# EasyEDA Pro project ros小车控制板.epro, schematic ROS-CAR-SCH

## Sheets
1 Battery: Board Name: 1.GCARCv5_2; Create Date: 2024-12-23; Page Name: v5.2电源; Project Name: 通用小车控制器sGCARC; Schematic Name: v5.2SCH; Update Date: 2025-01-11; Company: 湖南工业职业技术学院; Drawed: 唐杰; Page Size: A3; Part Number: JLCPCB-001; Reviewed: 唐杰; Version: v5.2
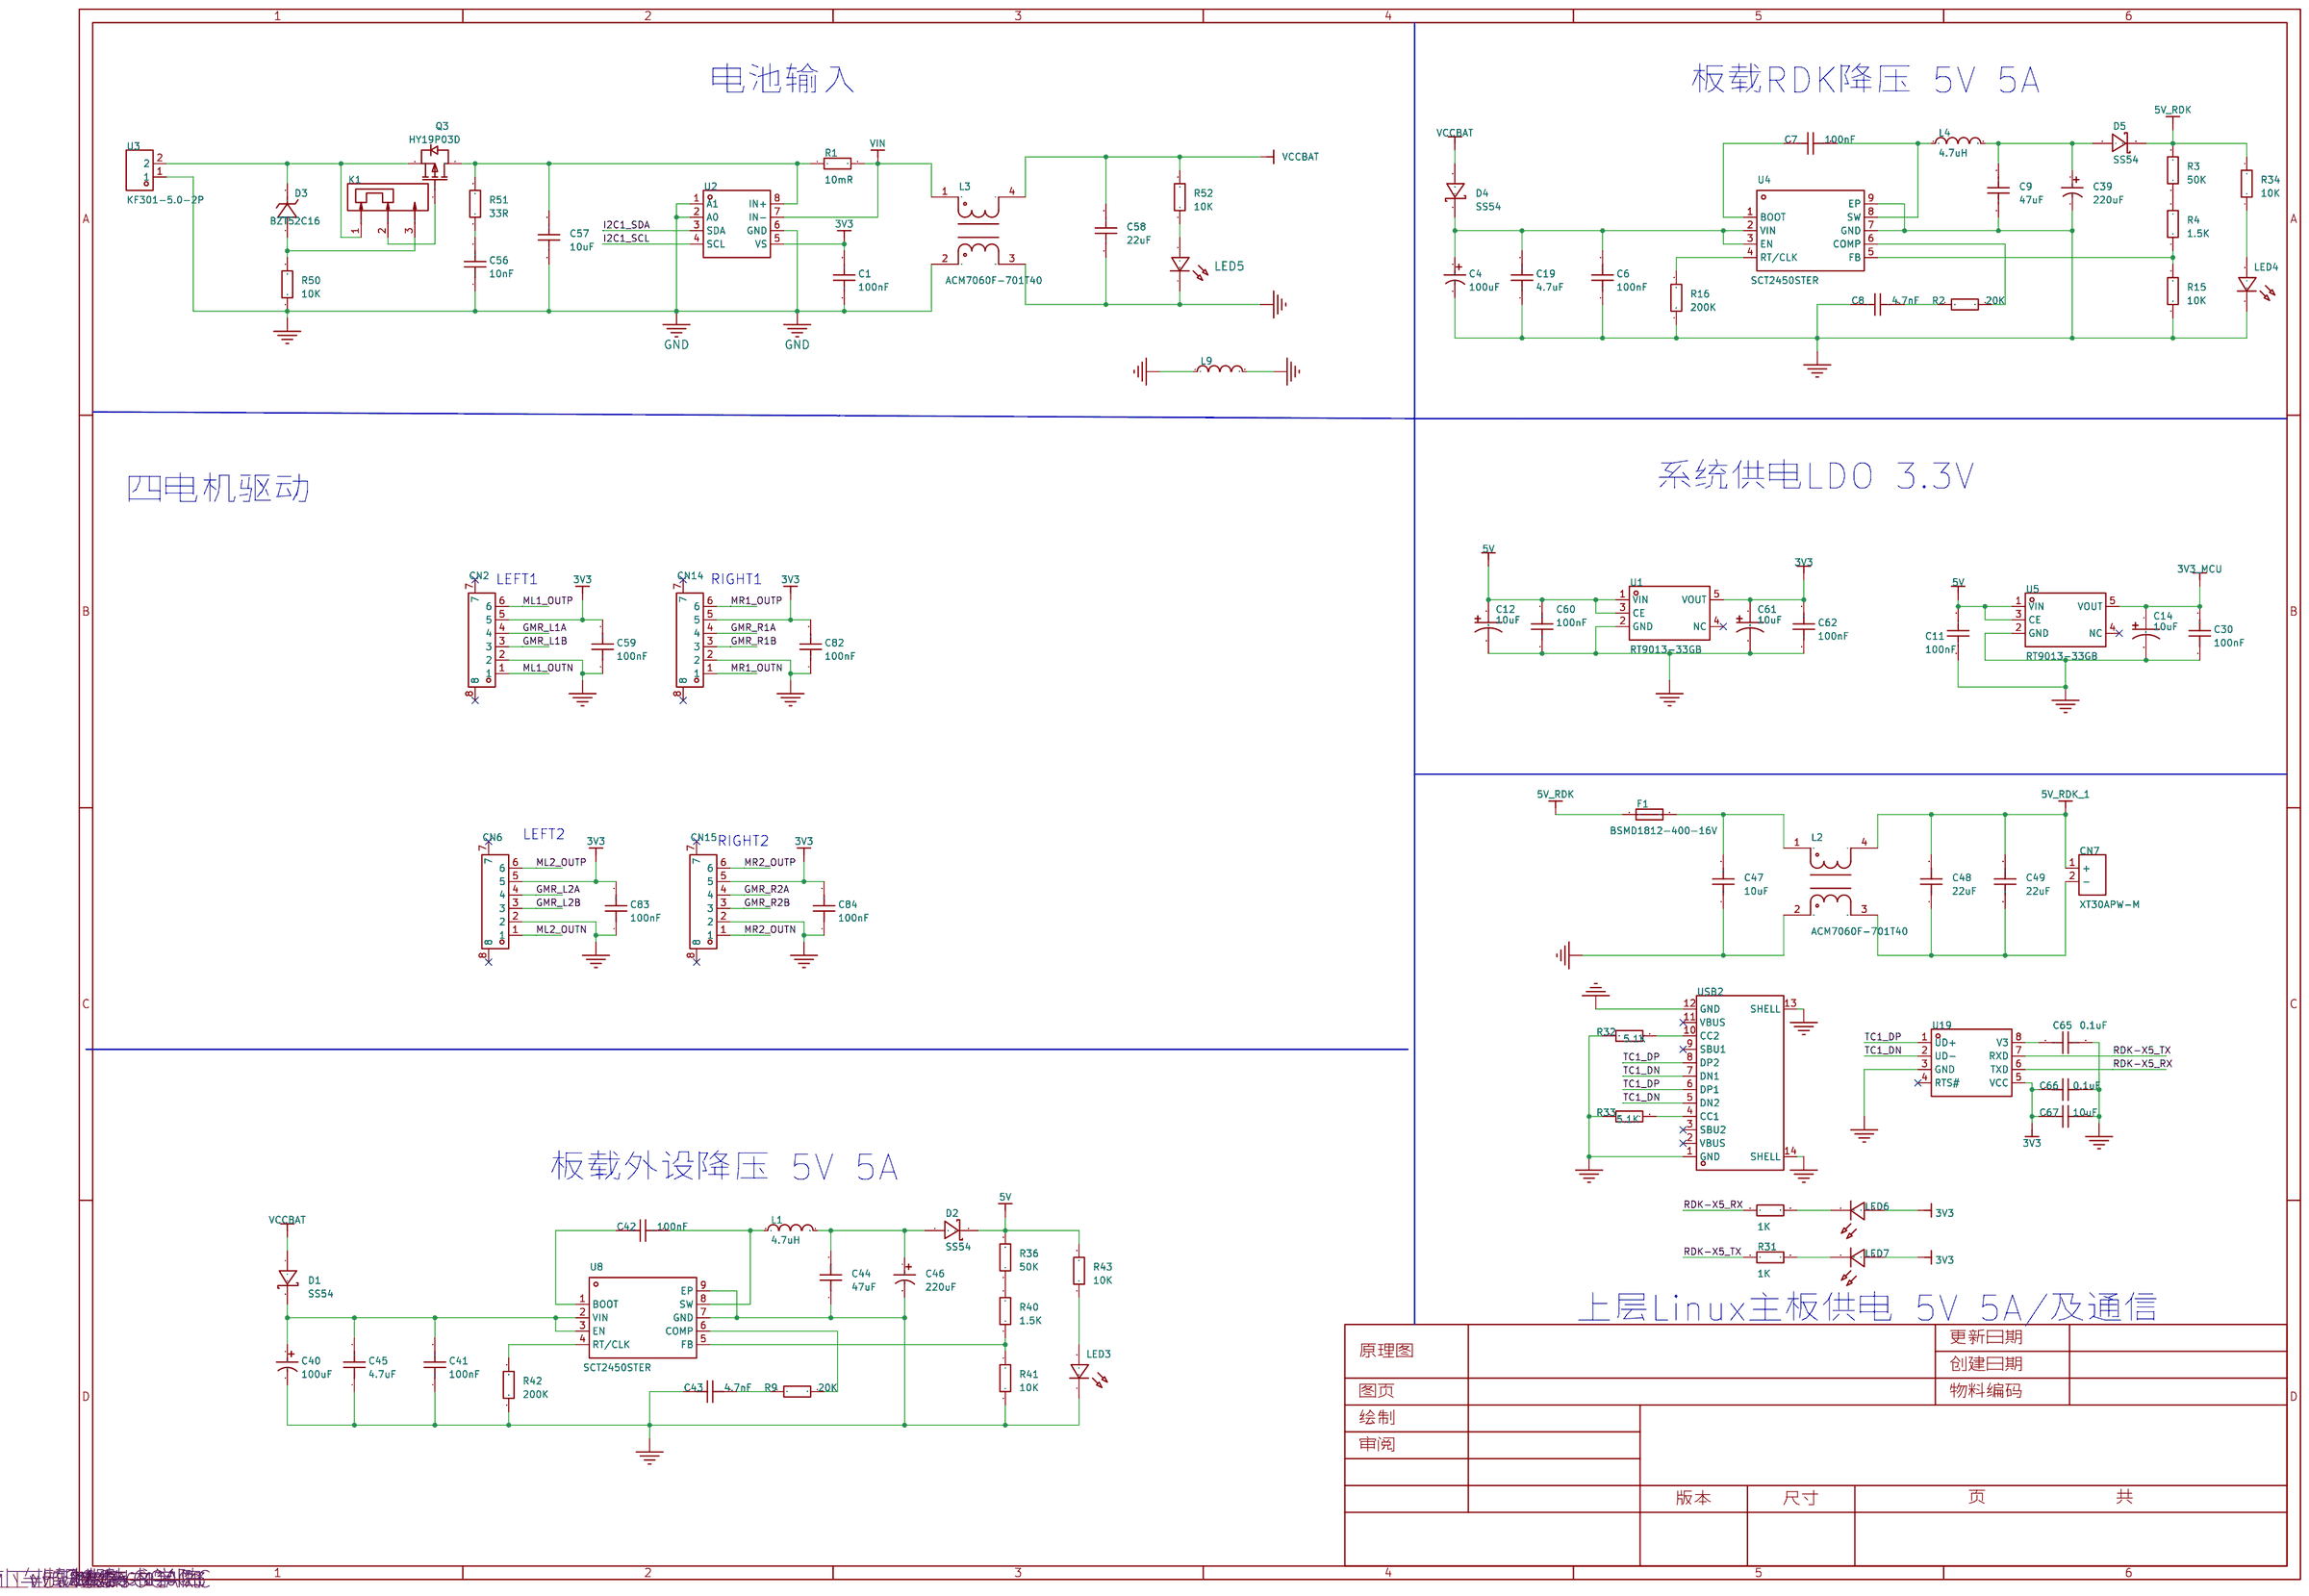
[diagram p0: Battery]
2 function: Page Name: v5.2功能
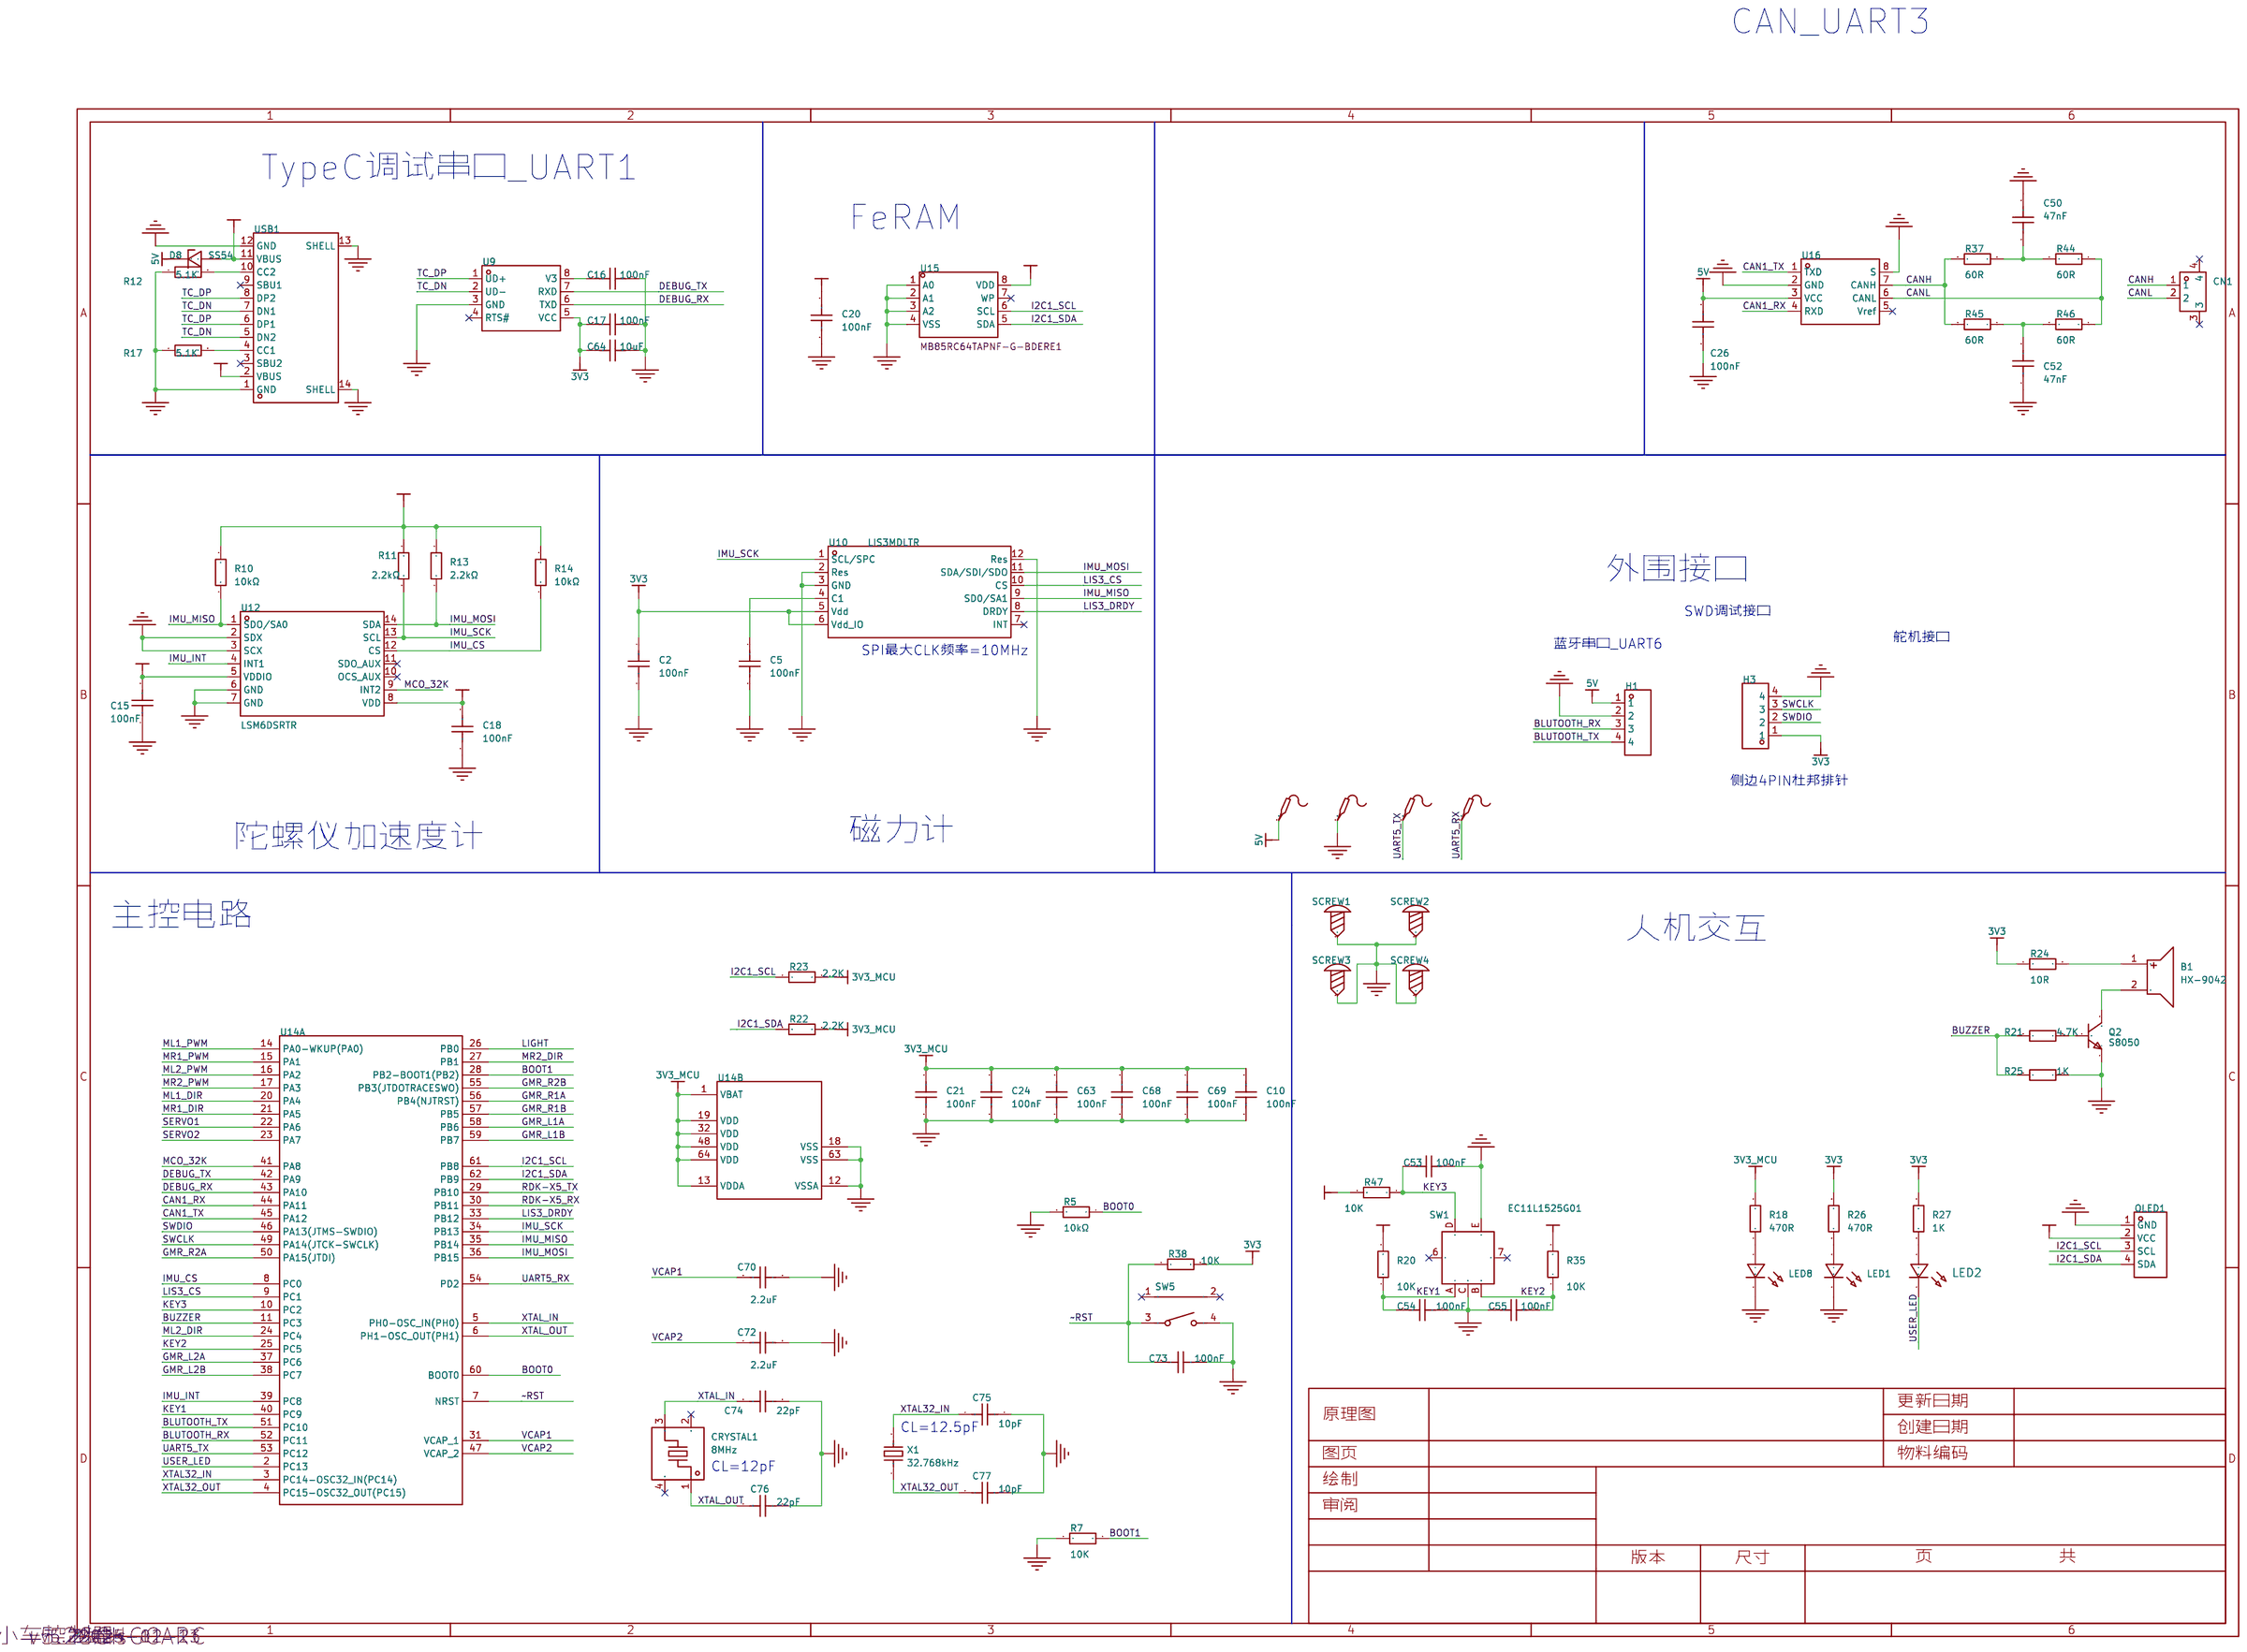
[diagram p1: function]
3 Driver: Assembly Variant: Basic; Board Name: ROS-CAR; Create Date: 2026-07-26; Page Name: P1; Project Name: ros小车控制板V2.0; Schematic Name: ROS-CAR-SCH; Update Date: 2026-07-26; BladeWidth: 10; Company: 嘉立创EDA; Page Size: A4; RegionStart: 1; ShowBorder: 1; TitleBlock: 1; TitleBlockPosition: 3; Version: V1.0; XRegionCount: 6; YRegionCount: 4
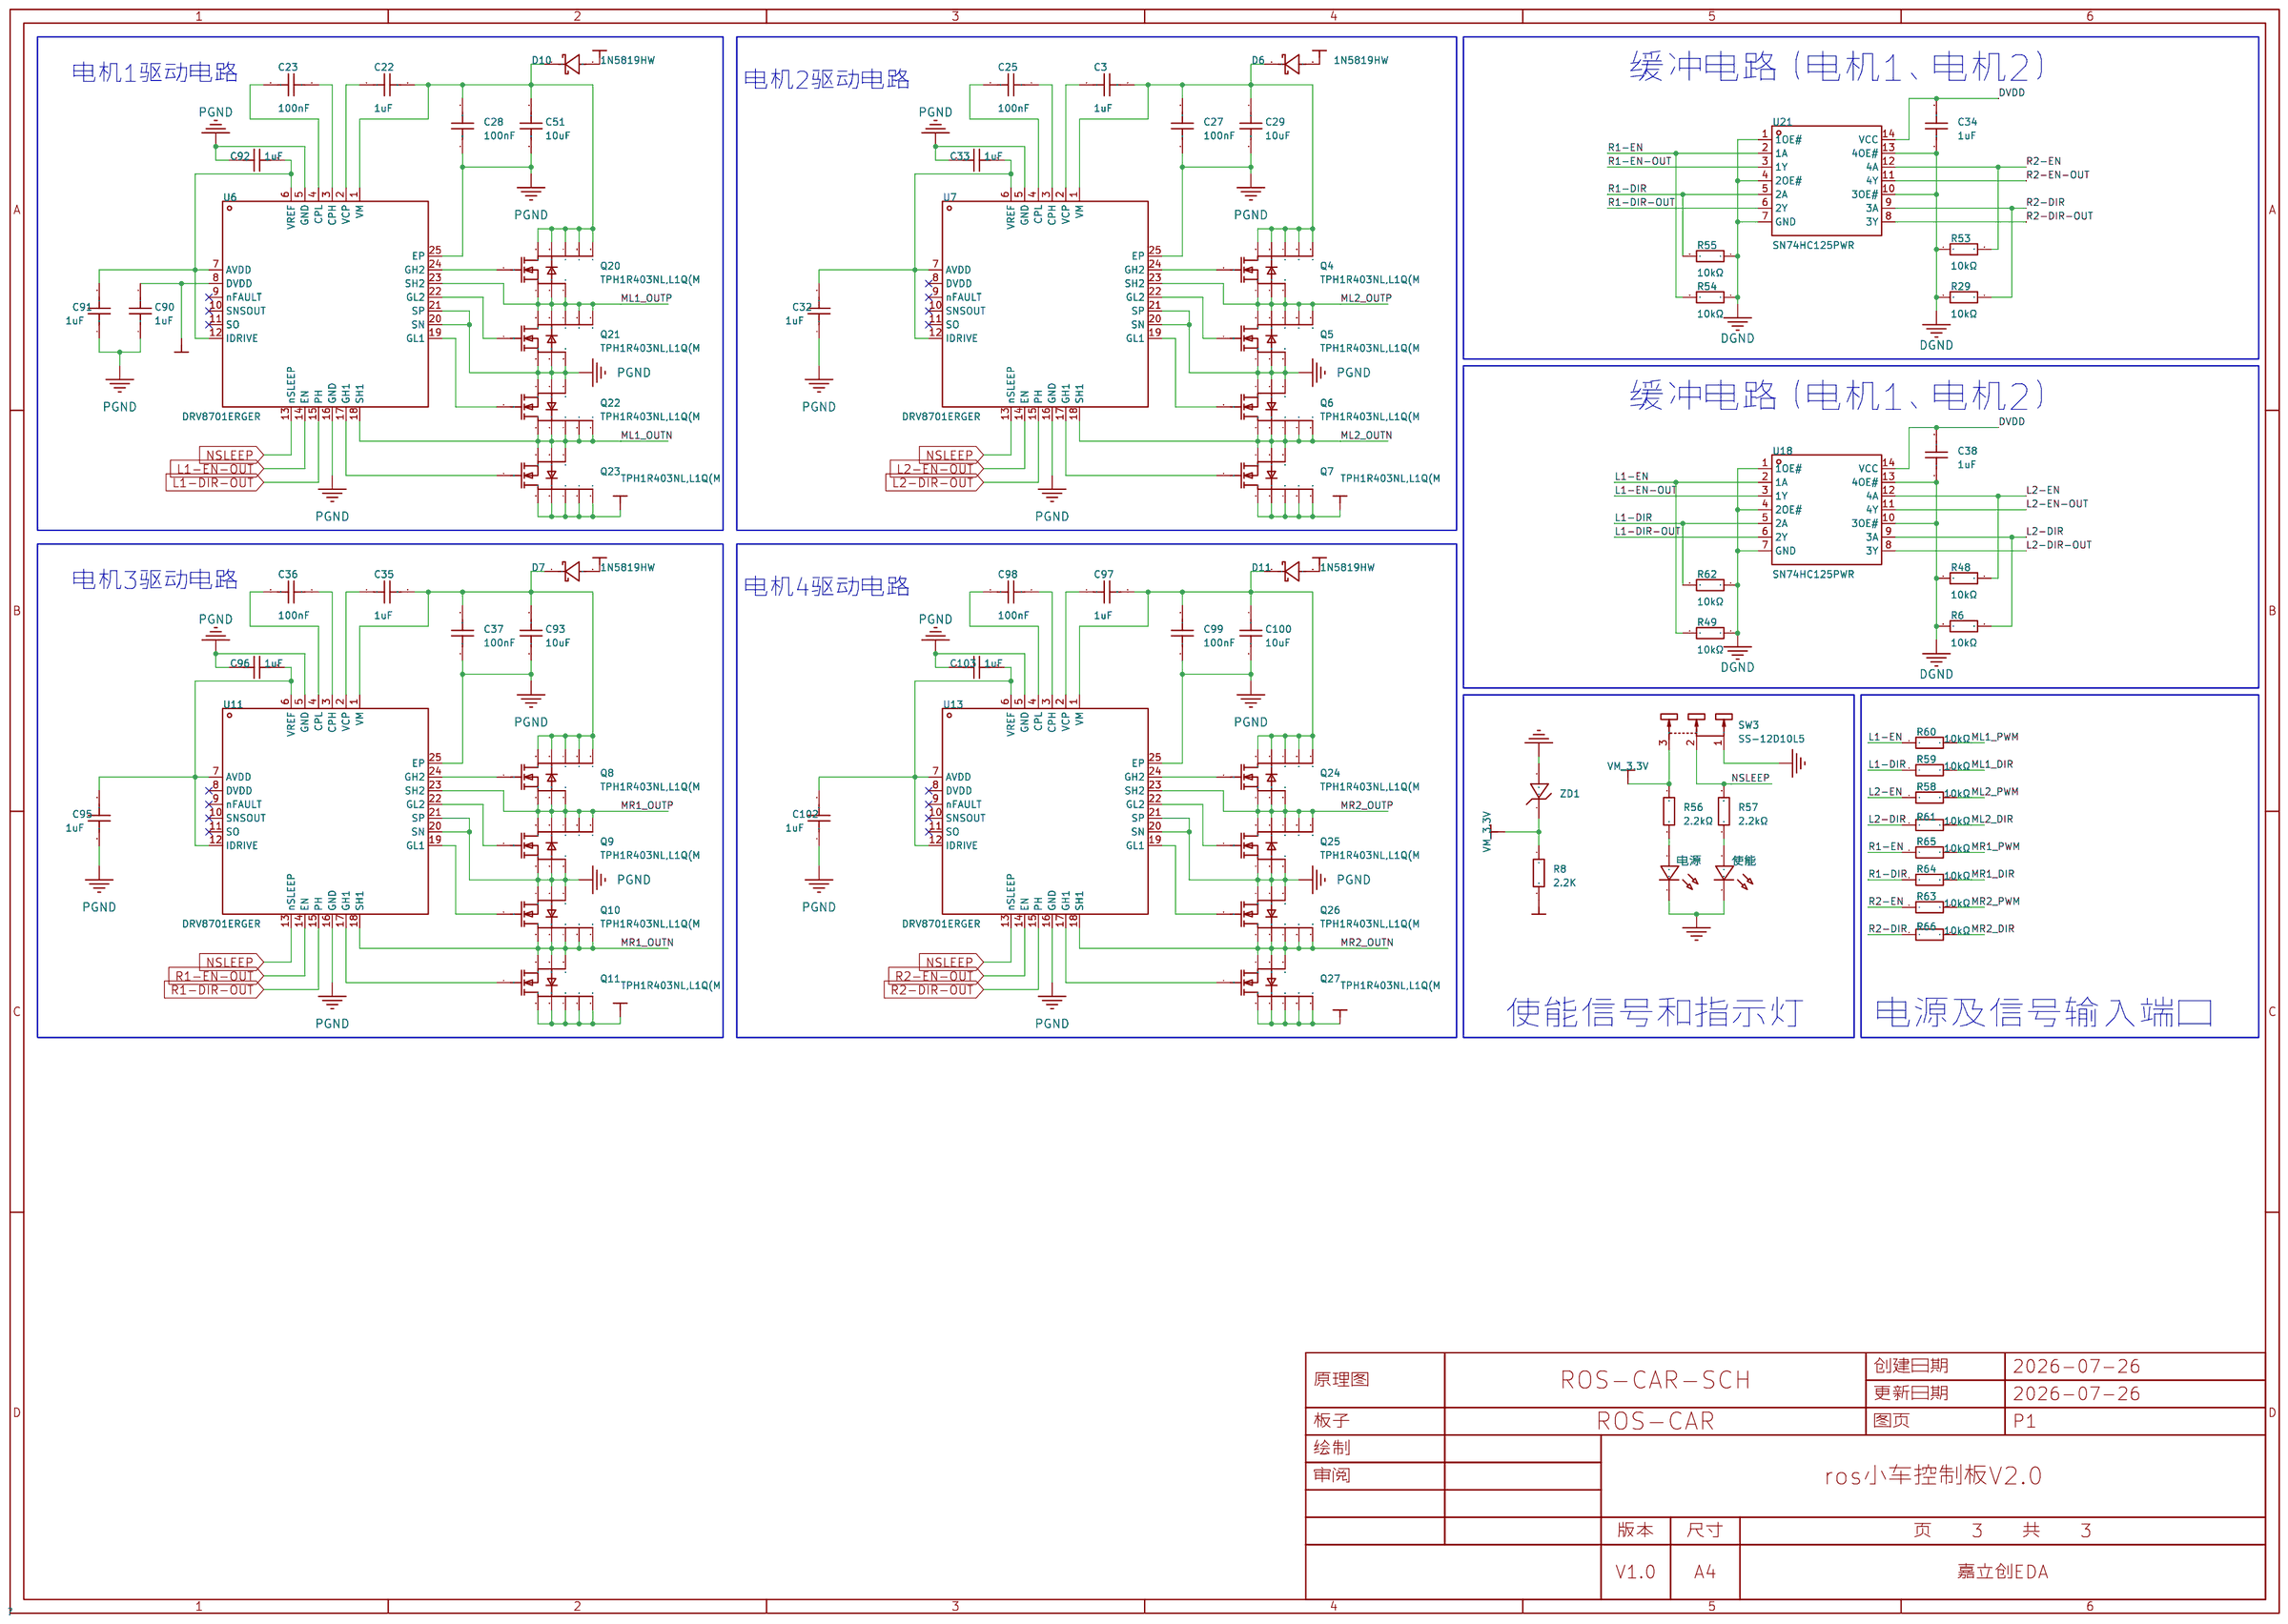
[diagram p2: Driver]

## Parts
sheet Battery
C1  100nF  [C0603]
C4  100uF  [CAP-SMD_BD6.3-L6.6-W6.6-LS7.6-FD-1]
C6  100nF  [C0603]
C7  100nF  [C0603]
C8  100nF  [C0603]
C9  100nF  [C1206]
C11  100nF  [C0603]
C12  10uF  [CAP-SMD_L3.2-W1.6]
C14  10uF  [CAP-SMD_L3.2-W1.6]
C19  100nF  [C1206]
C30  100nF  [C0603]
C39  220uF  [CAP-SMD_BD6.3-L6.6-W6.6-LS7.2-FD]
C40  100uF  [CAP-SMD_BD6.3-L6.6-W6.6-LS7.6-FD-1]
C41  100nF  [C0603]
C42  100nF  [C0603]
C43  100nF  [C0603]
C44  100nF  [C1206]
C45  100nF  [C1206]
C46  220uF  [CAP-SMD_BD6.3-L6.6-W6.6-LS7.2-FD]
C47  10uF  [C1206]
C48  22uF  [C1206]
C49  22uF  [C1206]
C56  100nF  [C0603]
C57  10uF  [C1206]
C58  22uF  [C1206]
C59  100nF  [C0603]
C60  100nF  [C0603]
C61  10uF  [CAP-SMD_L3.2-W1.6]
C62  100nF  [C0603]
C65  0.1uF  [C0603]
C66  0.1uF  [C0603]
C67  100nF  [C0603]
C82  100nF  [C0603]
C83  100nF  [C0603]
C84  100nF  [C0603]
CN2  HCZZ0021-6  [CONN-SMD_HCZZ0021-6]
CN6  HCZZ0021-6  [CONN-SMD_HCZZ0021-6]
CN7  XT30APW-M  [CONN-TH_XT30APW-M]
CN14  HCZZ0021-6  [CONN-SMD_HCZZ0021-6]
CN15  HCZZ0021-6  [CONN-SMD_HCZZ0021-6]
D1  SS54  [SMA_L4.4-W2.8-LS5.4-R-RD]
D2  SS54  [SMA_L4.4-W2.8-LS5.4-R-RD]
D3  BZT52C16  [SOD-123_L2.7-W1.6-LS3.7-RD]
D4  SS54  [SMA_L4.4-W2.8-LS5.4-R-RD]
D5  SS54  [SMA_L4.4-W2.8-LS5.4-R-RD]
F1  BSMD1812-400-16V  [F1812]
K1  -  [SW-TH_SS-12D10-G050]
L1  4.7uH  [IND-SMD_L5.5-W5.2]
L2  ACM7060F-701T40  [FILTER-SMD_4P-L7.0-W6.0-TL_ACM7060F]
L3  ACM7060F-701T40  [FILTER-SMD_4P-L7.0-W6.0-TL_ACM7060F]
L4  4.7uH  [IND-SMD_L5.5-W5.2]
L9  FBMA-11-160808-221A20T  [L0603]
LED3  -  [LED_0603]
LED4  -  [LED_0603]
LED5  -  [LED_0603]
LED6  -  [LED_0603]
LED7  -  [LED_0603]
Q3  HY19P03D  [TO-252-3_L6.5-W5.8-P4.58-BL]
R1  10mR  [R1206]
R2  10K  [R0603_2]
R3  10K  [R0603_2]
R4  1.5K  [R0603_2]
R9  10K  [R0603_2]
R15  10K  [R0603_2]
R16  10K  [R0603_2]
R30  10K  [R0603_2]
R31  10K  [R0603_2]
R32  5.1K  [R0603]
R33  5.1K  [R0603]
R34  10K  [R0603_2]
R36  10K  [R0603_2]
R40  1.5K  [R0603_2]
R41  10K  [R0603_2]
R42  10K  [R0603_2]
R43  10K  [R0603_2]
R50  10K  [R0603_2]
R51  10K  [R0603_2]
R52  10K  [R0603_2]
U1  RT9013-33GB  [SOT-23-5_L2.9-W1.6-P0.95-LS2.8-BR]
U2  INA219AID  [SOIC-8_L4.9-W3.9-P1.27-LS6.0-BL]
U3  KF301-5.0-2P  [CONN-TH_P5.00_KF301-5.0-2P]
U4  SCT2450STER  [ESOP-8_L4.9-W3.9-P1.27-LS6.0-BL-EP]
U5  RT9013-33GB  [SOT-23-5_L2.9-W1.6-P0.95-LS2.8-BR]
U8  SCT2450STER  [ESOP-8_L4.9-W3.9-P1.27-LS6.0-BL-EP]
U19  CH340N  [SOP-8_L4.9-W3.9-P1.27-LS6.0-BL]
USB2  TYPE-C 16PIN 2MD(073)  [USB-C-SMD_TYPE-C-6PIN-2MD-073]
sheet Driver
C3  1uF  [C0603_3]
C22  1uF  [C0603_3]
C23  100nF  [C0603_3]
C25  100nF  [C0603_3]
C27  100nF  [C0603_3]
C28  100nF  [C0603_3]
C29  10uF  [C0603_3]
C32  1uF  [C0603_3]
C33  1uF  [C0603_3]
C34  1uF  [C0603_3]
C35  1uF  [C0603_3]
C36  100nF  [C0603_3]
C37  100nF  [C0603_3]
C38  1uF  [C0603_3]
C51  10uF  [C0603_3]
C90  1uF  [C0603_3]
C91  1uF  [C0603_3]
C92  1uF  [C0603_3]
C93  10uF  [C0603_3]
C95  1uF  [C0603_3]
C96  1uF  [C0603_3]
C97  1uF  [C0603_3]
C98  100nF  [C0603_3]
C99  100nF  [C0603_3]
C100  10uF  [C0603_3]
C102  1uF  [C0603_3]
C103  1uF  [C0603_3]
D6  1N5819HW  [SOD-123_L2.7-W1.6-LS3.7-RD-1]
D7  1N5819HW  [SOD-123_L2.7-W1.6-LS3.7-RD-1]
D10  1N5819HW  [SOD-123_L2.7-W1.6-LS3.7-RD-1]
D11  1N5819HW  [SOD-123_L2.7-W1.6-LS3.7-RD-1]
Q4  TPH1R403NL,L1Q(M  [DSOP-8_L5.0-W5.0-P1.27-LS6.0-BL-EP]
Q5  TPH1R403NL,L1Q(M  [DSOP-8_L5.0-W5.0-P1.27-LS6.0-BL-EP]
Q6  TPH1R403NL,L1Q(M  [DSOP-8_L5.0-W5.0-P1.27-LS6.0-BL-EP]
Q7  TPH1R403NL,L1Q(M  [DSOP-8_L5.0-W5.0-P1.27-LS6.0-BL-EP]
Q8  TPH1R403NL,L1Q(M  [DSOP-8_L5.0-W5.0-P1.27-LS6.0-BL-EP]
Q9  TPH1R403NL,L1Q(M  [DSOP-8_L5.0-W5.0-P1.27-LS6.0-BL-EP]
Q10  TPH1R403NL,L1Q(M  [DSOP-8_L5.0-W5.0-P1.27-LS6.0-BL-EP]
Q11  TPH1R403NL,L1Q(M  [DSOP-8_L5.0-W5.0-P1.27-LS6.0-BL-EP]
Q20  TPH1R403NL,L1Q(M  [DSOP-8_L5.0-W5.0-P1.27-LS6.0-BL-EP]
Q21  TPH1R403NL,L1Q(M  [DSOP-8_L5.0-W5.0-P1.27-LS6.0-BL-EP]
Q22  TPH1R403NL,L1Q(M  [DSOP-8_L5.0-W5.0-P1.27-LS6.0-BL-EP]
Q23  TPH1R403NL,L1Q(M  [DSOP-8_L5.0-W5.0-P1.27-LS6.0-BL-EP]
Q24  TPH1R403NL,L1Q(M  [DSOP-8_L5.0-W5.0-P1.27-LS6.0-BL-EP]
Q25  TPH1R403NL,L1Q(M  [DSOP-8_L5.0-W5.0-P1.27-LS6.0-BL-EP]
Q26  TPH1R403NL,L1Q(M  [DSOP-8_L5.0-W5.0-P1.27-LS6.0-BL-EP]
Q27  TPH1R403NL,L1Q(M  [DSOP-8_L5.0-W5.0-P1.27-LS6.0-BL-EP]
R6  10kΩ  [R0603_6]
R8  2.2K  [R0603_7]
R29  10kΩ  [R0603_6]
R48  10kΩ  [R0603_6]
R49  10kΩ  [R0603_6]
R53  10kΩ  [R0603_6]
R54  10kΩ  [R0603_6]
R55  10kΩ  [R0603_6]
R56  2.2kΩ  [R0603_6]
R57  2.2kΩ  [R0603_6]
R58  10kΩ  [R0603_6]
R59  10kΩ  [R0603_6]
R60  10kΩ  [R0603_6]
R61  10kΩ  [R0603_6]
R62  10kΩ  [R0603_6]
R63  10kΩ  [R0603_6]
R64  10kΩ  [R0603_6]
R65  10kΩ  [R0603_6]
R66  10kΩ  [R0603_6]
SW3  SS-12D10L5  [SW-TH_SS-12D10L5]
U6  DRV8701ERGER  [VQFN-24_L4.0-W4.0-P0.50-BL-EP2.5_1]
U7  DRV8701ERGER  [VQFN-24_L4.0-W4.0-P0.50-BL-EP2.5_1]
U11  DRV8701ERGER  [VQFN-24_L4.0-W4.0-P0.50-BL-EP2.5_1]
U13  DRV8701ERGER  [VQFN-24_L4.0-W4.0-P0.50-BL-EP2.5_1]
U18  SN74HC125PWR  [TSSOP-14_L5.0-W4.4-P0.65-LS6.5-BL]
U21  SN74HC125PWR  [TSSOP-14_L5.0-W4.4-P0.65-LS6.5-BL]
ZD1  BZT52C3V3  [SOD-123_L2.8-W1.8-LS3.7-RD]
使能  NCD0603Y2  [LED0603-RD]
电源  NCD0603Y2  [LED0603-RD]
sheet function
5V  -  [Test-Point-0.5mm]
B1  HX-9042  [BUZ-TH_BD9.0-P4.00-D0.6-FD]
C2  100nF  [C0603_1]
C5  100nF  [C0603_1]
C10  100nF  [C0603_1]
C15  100nF  [C0603_1]
C16  100nF  [C0603_1]
C17  100nF  [C0603_1]
C18  100nF  [C0603_1]
C20  100nF  [C0603_1]
C21  100nF  [C0603_1]
C24  100nF  [C0603_1]
C26  100nF  [C0603_1]
C50  47nF  [C0603]
C52  47nF  [C0603]
C53  100nF  [C0603_1]
C54  100nF  [C0603_1]
C55  100nF  [C0603_1]
C63  100nF  [C0603_1]
C64  100nF  [C0603]
C68  100nF  [C0603_1]
C69  100nF  [C0603_1]
C70  2.2uF  [C0603_5]
C72  2.2uF  [C0603_5]
C73  100nF  [C0603_1]
C74  22pF  [C0603_5]
C75  10pF  [C0603_5]
C76  22pF  [C0603_5]
C77  10pF  [C0603_5]
CN1  ZX-XH2.54-2PWT  [CONN-SMD_2P-P2.54_MEGASTAR_ZX-XH2.54-2PWT]
CRYSTAL1  8MHz  [CRYSTAL-SMD_4P-L3.2-W2.5-BL_SIT8008BI_1]
D8  SS54  [SMA_L4.3-W2.6-LS5.0-FD]
GND  -  [Test-Point-0.5mm]
H1  -  [HDR-TH_4P-P2.54-V-F]
H3  PZ254R-11-04P  [HDR-TH_4P-P2.54-H-M-W10.4]
LED1  -  [LED_0603]
LED2  -  [LED_0603]
LED8  -  [LED_0603]
OLED1  HS96L01W4S03  [OLED-TH_HS96L01W4S03]
Q2  S8050  [SOT-23-3_L2.9-W1.3-P1.90-LS2.4-BR]
R5  10kΩ  [R0603_1]
R7  10K  [R0603_8]
R10  10kΩ  [R0603_1]
R11  2.2kΩ  [R0603_1]
R12  5.1K  [R0603]
R13  2.2kΩ  [R0603_1]
R14  10kΩ  [R0603_1]
R17  5.1K  [R0603]
R18  470R  [R0603]
R20  10K  [R0603]
R21  10K  [R0603_2]
R22  2.2K  [R0603_8]
R23  2.2K  [R0603_8]
R24  10K  [R0603_2]
R25  10K  [R0603_2]
R26  470R  [R0603]
R27  1K  [R0603]
R35  10K  [R0603]
R37  60R  [R0603]
R38  10K  [R0603_8]
R44  60R  [R0603]
R45  60R  [R0603]
R46  60R  [R0603]
R47  10K  [R0603]
RX  -  [Test-Point-0.5mm]
SCREW1  -  [M3螺丝]
SCREW2  -  [M3螺丝]
SCREW3  -  [M3螺丝]
SCREW4  -  [M3螺丝]
SW1  EC11L1525G01  [SW-TH_ALPS_EC11L1525G01]
SW5  TS24CA  [SW-SMD_TS24CA_1]
TX  -  [Test-Point-0.5mm]
U9  CH340N  [SOP-8_L4.9-W3.9-P1.27-LS6.0-BL]
U10  LIS3MDLTR  [LGA-12_L2.0-W2.0-P0.50-BL]
U12  LSM6DSRTR  [LGA-14_L3.0-W2.5-P0.50-BR]
U14  STM32F405RGT6  [LQFP-64_L10.0-W10.0-P0.50-LS12.0-BL]  (sections 1,2)
U15  MB85RC64TAPNF-G-BDERE1  [SOP-8_L5.0-W4.0-P1.27-LS6.0-BL]
U16  TJA1050T-JSM  [SOIC-8_L4.9-W3.9-P1.27-LS6.0-BL]
USB1  TYPE-C 16PIN 2MD(073)  [USB-C-SMD_TYPE-C-6PIN-2MD-073]
X1  32.768kHz  [OSC-SMD_L3.2-W1.5]

## Library data of the parts
C1 C6-C8 C11 C30 C41-C43 C50 C52 C56 C59 C60 C62 C64-C67 C70 C72 C74-C77 C82-C84 = CAP_0603: Supplier Footprint: 0603
C4 C40 = RVE100UF35V67RV0072: 容值:100uF;精度:±20%;额定电压:35V;纹波电流:230mA@120Hz;等效串联电阻:600mΩ@100kHz;; LCSC Part Name: 100uF ±20% 35V; Supplier Part: C2836437; Manufacturer: KNSCHA(科尼盛); Supplier Footprint: SMD,D6.3xL7.7mm; JLCPCB Part Class: Extended Part; Datasheet: https://atta.szlcsc.com/upload/public/pdf/source/20220719/B52EB46F8A1558448ED03D8B4CB3C24F.pdf; Supplier: LCSC; Tolerance: ±20%; Rated Voltage: 35V; Ripple Current: 230mA@120Hz; Equivalent Series Resistance(ESR): 600mΩ@100kHz; φD: 6.3mm; L: 7.7mm; Lifetime @ Temp: 2000hrs@105℃; Operating Temperature: -55℃~+105℃
C9 C19 C44 C45 = CAP_1206: Supplier Footprint: 1206
C12 C14 C61 = CA45-106K016AT: 容值:10uF;精度:±10%;额定电压:16V;等效串联电阻:7Ω@100kHz;; LCSC Part Name: 10uF ±10% 16V; Supplier Part: C219747; Manufacturer: TANCAP(容电); Supplier Footprint: CASE-A-3216; JLCPCB Part Class: Extended Part; Datasheet: https://atta.szlcsc.com/upload/public/pdf/source/20180524/C219747_DA6D26CF659D253885244B1850EB1E9F.pdf; Supplier: LCSC; Tolerance: ±10%; Rated Voltage: 16V; Equivalent Series Resistance(ESR): 7Ω@100kHz; Operating Temperature: -55℃~+85℃
C39 C46 = RST220UF25V019: 容值:220uF;精度:±20%;额定电压:25V;纹波电流:165mA@120Hz;等效串联电阻:-;; LCSC Part Name: 220uF ±20% 25V; Supplier Part: C4747974; Manufacturer: KNSCHA(科尼盛); Supplier Footprint: SMD,D6.3xL7.7mm; JLCPCB Part Class: Extended Part; Datasheet: https://atta.szlcsc.com/upload/public/pdf/source/20220722/2E7F51AC9BE193B364DA1207D7353D66.pdf; Supplier: LCSC; Tolerance: ±20%; Rated Voltage: 25V; Ripple Current: 165mA@120Hz; φD: 6.3mm; L: 7.7mm; Lifetime @ Temp: 2000hrs@105℃; Operating Temperature: -40℃~+105℃
C47 C57 = CL31A106KAHNNNE: 容值:10uF;精度:±10%;额定电压:25V;材质(温度系数):X5R;; LCSC Part Name: 10uF ±10% 25V; Supplier Part: C9807; Manufacturer: SAMSUNG(三星); Supplier Footprint: 1206; JLCPCB Part Class: Extended Part; Datasheet: https://atta.szlcsc.com/upload/public/pdf/source/20160218/1457707763339.pdf; Supplier: LCSC; Tolerance: ±10%; Voltage Rated: 25V; Temperature Coefficient: X5R
C48 C49 C58 = CL31A226KAHNNNE: 容值:22uF;精度:±10%;额定电压:25V;材质(温度系数):X5R;; LCSC Part Name: 22uF ±10% 25V; Supplier Part: C12891; Manufacturer: SAMSUNG(三星); Supplier Footprint: 1206; JLCPCB Part Class: Basic Part; Datasheet: https://atta.szlcsc.com/upload/public/pdf/source/20160218/1457707763339.pdf; Supplier: LCSC; Tolerance: ±10%; Voltage Rated: 25V; Temperature Coefficient: X5R
CN2 CN6 CN14 CN15 = HCZZ0021-6: 插针结构:1x6P;间距:2.54mm;安装方式:卧贴;参考系列:XH;总PIN数:6P;排数:1;每排PIN数:6;额定电流:3A;触头材质:黄铜;触头镀层:锡;工作温度范围:-25℃~+85℃;; LCSC Part Name: 1x6P 间距:2.54mm 卧贴 系列:XH 米色; Supplier Part: C7433711; Manufacturer: HC(虹成电子); Supplier Footprint: SMD,P=2.54mm,卧贴; JLCPCB Part Class: 扩展库; Datasheet: https://atta.szlcsc.com/upload/public/pdf/source/20230707/EBD34B2F45667F1DC530D7576BB95823.pdf; Supplier: LCSC; Pins Structure: 1x6P; Pitch: 2.54mm; Mounting Style: 卧贴; Reference Series: XH; Number of Pins: 6P; Number of Rows: 1; Number of PINs Per Row: 6; Current Rating (Max): 3A; Contact Material: 黄铜; Contact Plating: 锡; Operating Temperature Range: -25℃~+85℃
CN7 = XT30APW-M: LCSC Part Name: AMASS(艾迈斯)防水锁扣镀金15A二芯插头 PCB板卧式 黄色 公头XT30APW-M; Supplier Part: C5818955; Manufacturer: AMASS(艾迈斯); JLCPCB Part Class: Extended Part; Supplier: LCSC
D1 D2 D4 D5 = SS54_C22452: 正向压降(Vf):550mV@5A;直流反向耐压(Vr):40V;平均整流电流(Io):5A;; LCSC Part Name: 电压:40V 电流:5A; Supplier Part: C22452; Manufacturer: MDD; Supplier Footprint: SMA(DO-214AC); JLCPCB Part Class: 基础库; Datasheet: https://atta.szlcsc.com/upload/public/pdf/source/20230314/529CD85F9B31F69841D3A079BC07E377.pdf; Supplier: LCSC; Forward Voltage (Vf@If): 550mV@5A; Reverse Voltage (Vr): 40V; Average Rectified Current (Io): 5A; Reverse Leakage Current (Ir): 1mA@40V
D3 = BZT52C16: 稳压值(标称值):-;功率:500mW;精度:-;; Supplier Part: C707145; Manufacturer: Slkor(萨科微); Supplier Footprint: SOD-123; JLCPCB Part Class: 扩展库; Datasheet: https://atta.szlcsc.com/upload/public/pdf/source/20200721/C707125_BAEA70ACC1B0F60BBAC1FD71D8806D24.pdf; Supplier: LCSC; Reverse Leakage Current (Ir): 100nA@11.2V; Power Dissipation: 500mW
F1 = BSMD1812-400-16V: 耐压(Vmax):16V;最大电流(Imax):40A;保持电流(Ihold):4A;跳闸电流(Itrip):8A;; LCSC Part Name: 1812 4A 16V 佰宏高电压; Supplier Part: C47263807; Manufacturer: BHFUSE(佰宏); Supplier Footprint: 1812; JLCPCB Part Class: Extended Part; Datasheet: https://item.szlcsc.com/datasheet/BSMD1812-400-16V/49469359.html; Supplier: LCSC; Voltage - Max: 16V; Current - Max: 40A; Hold Current: 4A; Trip Current: 8A; Power Dissipation: 2W; Resistance - Initial (Ri) (Min): 5mΩ; Resistance - Post Trip (R1) (Max): 25mΩ; Time to Trip(Max): 4s; Operating Temperature: -40℃~+85℃
K1 = SS-12D10-G5: LCSC Part Name: 插件大电流拨动开关; Supplier Part: C2998777; Manufacturer: DEALON(德艺隆); Supplier Footprint: 插件; Datasheet: https://atta.szlcsc.com/upload/public/pdf/source/20220428/E10CB334ACBAF32CF4AF8D87DA871CD3.pdf; Supplier: LCSC
L1 L4 = SMMS0530-4R7M: 类型:一体成型电感;电感值:4.7uH;精度:±20%;额定电流:4.5A;饱和电流(Isat):5A;; LCSC Part Name: 4.7uH ±20% 5A; Supplier Part: C181722; Manufacturer: SXN(顺翔诺); Supplier Footprint: SMD; JLCPCB Part Class: Extended Part; Datasheet: https://atta.szlcsc.com/upload/public/pdf/source/20210810/BBF24330FB2F5029F637830BA9C42C0D.pdf; Supplier: LCSC; Type: 一体成型电感; Tolerance: ±20%; Rated Current: 4.5A; Saturation Current (Isat): 5A; DC Resistance (DCR): 60mΩ
L2 L3 = ACM7060F-701T40: 线路数:2;阻抗 @ 频率:700Ω@100MHz;直流电阻(DCR):15mΩ;; Supplier Part: C908568; Manufacturer: Meled(美莱); Supplier Footprint: SMD,7x6mm; JLCPCB Part Class: 扩展库; Datasheet: https://atta.szlcsc.com/upload/public/pdf/source/20201026/C908588_5CEB65C28001E8C7405DCE17723F19DE.pdf; Supplier: LCSC; Number of Lines: 2; Impedance @ Frequency: 700Ω@100MHz; Current Rating: 4A; DC Resistance (DCR): 15mΩ; Voltage Rating - DC: 125V; Operating Temperature: -40℃~+125℃
L9 = FBMA-11-160808-221A20T: 标称阻抗@测试频率:220Ω@100MHz;误差:±25%;直流电阻(RDC):100mΩ;; LCSC Part Name: 单路 0603磁珠 阻抗220Ω@100MHz; Supplier Part: C491561; Manufacturer: Kingcore(钧宝); Supplier Footprint: 0603; JLCPCB Part Class: 扩展库; Datasheet: https://atta.szlcsc.com/upload/public/pdf/source/20200318/C491555_33530977E41FC6ED0B377F6D664F401F.pdf; Supplier: LCSC; Impedance @ Frequency: 220Ω@100MHz; Tolerance: ±25%; DC Resistance: 100mΩ; Current Rating: 2A; Circuits: 1
LED3 LED4 LED7 = LED_0603-G_1: Supplier Footprint: 0603
LED5 = LED_0603-R_1: Supplier Footprint: 0603
LED6 = LED_0603-B: Supplier Footprint: 0603
Q3 = HY19P03D_C330375: 漏源电压（Vdss）:-30V;连续漏极电流（Id）（25°C 时）:90A(Tc);栅源极阈值电压:3V @ 250uA;漏源导通电阻:6mΩ @ 45A,10V;最大功率耗散（Ta=25°C）:50W(Tc);类型:P沟道;; Supplier Part: C330375; Supplier Footprint: TO-252-2L; JLCPCB Part Class: 扩展库; Datasheet: https://atta.szlcsc.com/upload/public/pdf/source/20181108/C330375_BA5D69AA7EC063D0F6F0CEB9136BFE2D.pdf; Supplier: LCSC
R1 = Res_1206: Supplier Footprint: 1206
R2-R4 R7 R9 R12 R15-R18 R20-R27 R30-R38 R40-R47 R50-R52 = Res_0603: Supplier Footprint: 0603
U1 U5 = RT9013-33GB_C19268157: Supplier Part: C19268157; Manufacturer: TECH PUBLIC(台舟); Supplier Footprint: SOT-23-5; JLCPCB Part Class: 扩展库; Datasheet: https://atta.szlcsc.com/upload/public/pdf/source/20231201/9D78CA17020D67EC103F1AC7C29CF260.pdf; Supplier: LCSC
U2 = INA219AID: INA219 26V 12 位 I2C 输出数字功率监测器; Supplier Part: C1574856; Manufacturer: TI(德州仪器); Supplier Footprint: SOIC-8; JLCPCB Part Class: 扩展库; Datasheet: https://www.ti.com/cn/lit/gpn/ina219; Supplier: LCSC
U3 = KF301-5.0-2P: 结构:1x2P;间距:5mm;颜色:蓝色;安装方式:直插;额定电流:17A;额定电压:250V;排数:1;线规 - AWG:14~22;线规 - 平方毫米:1.5;每排PIN数:2;工作温度范围:-30℃~+120℃;; LCSC Part Name: 5mm 1x2P 排数:1 每排P数:2 直插; Supplier Part: C474881; Manufacturer: KEFA(科发); Supplier Footprint: 插件,P=5mm; JLCPCB Part Class: 扩展库; Datasheet: https://atta.szlcsc.com/upload/public/pdf/source/20230317/03A5B5FC229D6F9225E8F51DA1A4E80A.pdf; Supplier: LCSC; Structure: 1x2P; Pitch: 5mm; Color: 蓝色; Mounting Style: 直插; Current Rating (Max): 17A; Voltage Rating (Max): 250V; Number of Pins: 2P; Number of Rows: 1; Wire Gauge - AWG: 14~22; Wire Gauge - mm2: 1.5; Number of PINs Per Row: 2; Operating Temperature Range: -30℃~+120℃
U4 U8 = SCT2450STER: LCSC Part Name: 电源IC; Supplier Part: C509400; Manufacturer: SCT(芯洲科技); Supplier Footprint: ESOP-8; JLCPCB Part Class: 扩展库; Datasheet: https://atta.szlcsc.com/upload/public/pdf/source/20200407/C509400_EDF779A672A59398CFBA9E95FA584FEC.pdf; Supplier: LCSC
U9 U19 = CH340N: Supplier Part: C2977777; Manufacturer: WCH(南京沁恒); Supplier Footprint: SOP-8; JLCPCB Part Class: Extended Part; Datasheet: https://atta.szlcsc.com/upload/public/pdf/source/20220223/82A45E4FF89B3EDCAD50B354450A7EF4.pdf; Supplier: LCSC
USB1 USB2 = TYPE-C 16PIN 2MD(073): 连接器类型:Type-C;标准:-;公母:母;触点数量:16P;端口数量:1;安装方式:卧贴;额定电流 - 电源:5A;工作温度范围:-25℃~+85℃;; LCSC Part Name: Type-C 母 卧贴 带定位柱 不锈钢外壳 2次模顶; Supplier Part: C2765186; Manufacturer: SHOU HAN(首韩); Supplier Footprint: SMD; JLCPCB Part Class: 扩展库; Datasheet: https://atta.szlcsc.com/upload/public/pdf/source/20211123/39B17C16241EAC15C5E277BDA434118E.pdf; Supplier: LCSC; Connector Type: Type-C; Gender: 母; Number of Contacts: 16P; Number of Ports: 1; Mounting Style: 卧贴; Current Rating - Power (Max): 5A; Operating Temperature Range: -25℃~+85℃
C3 C22 C29 C32 C35 C51 C90 C91 C93 C95 C97 C100 C102 = CAP_604: Supplier Footprint: 0603
C23 C25 C27 C28 C36 C37 C98 C99 = CGA0603X7R104K500JT: 容值:100nF;精度:±10%;额定电压:50V;温度系数:X7R;; LCSC Part Name: 100nF ±10% 50V; Supplier Part: C6119867; Manufacturer: HRE(芯声); Supplier Footprint: 0603; JLCPCB Part Class: Extended Part; Datasheet: https://item.szlcsc.com/datasheet/CGA0603X7R104K500JT/7062573.html; Supplier: LCSC; Tolerance: ±10%; Voltage Rating: 50V; Temperature Coefficient: X7R
C33 C34 C38 C92 C96 C103 = CGA0603X5R105K500JT: 容值:1uF;精度:±10%;额定电压:50V;温度系数:X5R;; LCSC Part Name: 1uF ±10% 50V; Supplier Part: C6119852; Manufacturer: HRE(芯声); Supplier Footprint: 0603; JLCPCB Part Class: Extended Part; Datasheet: https://item.szlcsc.com/datasheet/CGA0603X5R105K500JT/7062558.html; Supplier: LCSC; Tolerance: ±10%; Voltage Rating: 50V; Temperature Coefficient: X5R
D6 D7 D10 D11 = 1N5819HW: 二极管配置:-;正向压降(Vf):900mV@3A;直流反向耐压(Vr):40V;整流电流:1A;; LCSC Part Name: 电压:40V 电流:1A; Supplier Part: C2905649; Manufacturer: TECH PUBLIC(台舟); Supplier Footprint: SOD-123; JLCPCB Part Class: 扩展库; Datasheet: https://item.szlcsc.com/datasheet/1N5819HW/3175946.html; Supplier: LCSC; Voltage - Forward(Vf@If): 900mV@3A; Voltage - DC Reverse(Vr): 40V; Current - Rectified: 1A; Reverse Leakage Current (Ir): 1mA@40V; Non-Repetitive Peak Forward Surge Current: 9A
Q4-Q11 Q20-Q27 = TPH1R403NL,L1Q(M: 数量:1个N沟道;漏源电压(Vdss):30V;连续漏极电流(Id):150A;导通电阻(RDS(on)):2.1mΩ@4.5V;耗散功率(Pd):64W;阈值电压(Vgs(th)):2.3V@0.5mA;; LCSC Part Name: 1个N沟道 耐压:30V 电流:150A; Supplier Part: C2940403; Manufacturer: TOSHIBA(东芝); Supplier Footprint: DFN-8(5x6); JLCPCB Part Class: 扩展库; Datasheet: https://item.szlcsc.com/datasheet/TPH1R403NL%252CL1Q(M/3305005.html; Supplier: LCSC; Number: 1个N沟道; Drain to Source Voltage: 30V; Current - Continuous Drain(Id): 150A; RDS(on): 2.1mΩ@4.5V; Pd - Power Dissipation: 64W; Gate Threshold Voltage (Vgs(th)): 2.3V@0.5mA; Gate Charge(Qg): 46nC@10V; Input Capacitance(Ciss): 4.4nF; Reverse Transfer Capacitance (Crss@Vds): 200pF; Type: N沟道; Output Capacitance(Coss): 1.8nF
R6 R29 R48 R49 R53-R55 R58-R66 = 0603WAF1002T5E_1: 电阻类型:厚膜电阻;阻值:10kΩ;精度:±1%;功率:100mW;工作电压:75V;温度系数:±100ppm/℃;; LCSC Part Name: 厚膜电阻 10kΩ ±1% 100mW; Supplier Part: C25804; Manufacturer: UNI-ROYAL(厚声); Manufacturer Part: 0603WAF1002T5E; Supplier Footprint: 0603; JLCPCB Part Class: Basic Part; Datasheet: https://item.szlcsc.com/datasheet/0603WAF1002T5E/26547.html; Supplier: LCSC; Type: 厚膜电阻; Tolerance: ±1%; Power(Watts): 100mW; Voltage-Supply(Max): 75V; Temperature Coefficient: ±100ppm/℃; Operating Temperature: -55℃~+155℃
R8 = Res_604: Supplier Footprint: 0603
R56 R57 = 0603WAF2201T5E_1: 电阻类型:厚膜电阻;阻值:2.2kΩ;精度:±1%;功率:100mW;最大工作电压:75V;温度系数:±100ppm/℃;; LCSC Part Name: 2.2kΩ ±1% 100mW 厚膜电阻; Supplier Part: C4190; Manufacturer: UNI-ROYAL(厚声); Manufacturer Part: 0603WAF2201T5E; Supplier Footprint: 0603; JLCPCB Part Class: Basic Part; Datasheet: https://atta.szlcsc.com/upload/public/pdf/source/20200306/C422600_1E6D84923E4A46A82E41ADD87F860B5C.pdf; Supplier: LCSC; Type: 厚膜电阻; Tolerance: ±1%; Power(Watts): 100mW; Overload Voltage (Max): 75V; Temperature Coefficient: ±100ppm/℃; Operating Temperature Range: -55℃~+155℃
SW3 = SS-12D10L5: 电路结构:单刀双掷;安装方式:直插;开关颜色:黑色;额定电流:3A;额定电压:125V;工作寿命:1万次;; LCSC Part Name: 柄长5mm 直插双档 滑动开关; Supplier Part: C319012; Manufacturer: XKB Connection(中国星坤); Supplier Footprint: 插件,13x6.8mm; JLCPCB Part Class: 扩展库; Datasheet: https://item.szlcsc.com/datasheet/SS-12D10L5/300104.html; Supplier: LCSC; Circuit: 单刀双掷; Actuator Style: 矩形柱状; Termination Style: PC引脚; Length: 13mm; Width: 6.8mm; Switch Height: 6.4mm; Mounting Type: 直插; Actuator Color: 黑色; Current Rating: 3A; Voltage Rating: 125V; Life: 1万次; Operating Temperature: -40℃~+85℃
U6 U7 U11 U13 = DRV8701ERGER: DRV8701 47V H 桥智能栅极驱动器; LCSC Part Name: 有刷直流电机驱动芯片 45V; Supplier Part: C90964; Manufacturer: TI(德州仪器); Supplier Footprint: VQFN-24-EP(4x4); JLCPCB Part Class: 扩展库; Datasheet: https://www.ti.com/cn/lit/gpn/drv8701; Supplier: LCSC
U18 U21 = SN74HC125PWR: 输入类型:-;工作电压:2V~6V;元件数:4;每个元件位数:1;灌电流(IOL):7.8mA;拉电流(IOH):7.8mA;; LCSC Part Name: 三态输出，四路总线缓冲门; Supplier Part: C132994; Manufacturer: TI(德州仪器); Supplier Footprint: TSSOP-14; JLCPCB Part Class: 扩展库; Datasheet: https://www.ti.com/cn/lit/gpn/sn74hc125; Supplier: LCSC; output type: 三态; Voltage - Supply: 2V~6V; Number of Elements: 4; Number of Bits per Element: 1; Current - Output Low(IOL): 7.8mA; Current - Output High(IOH): 7.8mA; Logic Family: 74HC; Operating Temperature: -40℃~+85℃
ZD1 = BZT52C3V3_C2112: 二极管配置:独立式;稳压值(标称值):3.3V;稳压值(范围):3.1V~3.5V;精度:-;功率:350mW;反向电流(Ir):5A@1V;阻抗(Zzt):95Ω;; LCSC Part Name: 3.3V 350mW; Supplier Part: C2112; Manufacturer: CJ（江苏长电/长晶）; Supplier Footprint: SOD-123; JLCPCB Part Class: 扩展库; Datasheet: https://atta.szlcsc.com/upload/public/pdf/source/20170919/C2112_1505799672426977594.pdf; Supplier: LCSC; Diode Configuration: 独立式; Zener Voltage (Nom): 3.3V; Zener Voltage (Range): 3.1V~3.5V; Power Dissipation: 350mW; Reverse Leakage Current (Ir): 5A@1V; Zener Impedance (Zzt): 95Ω
使能 电源 = NCD0603Y2: 发光颜色:黄色;正向电压(VF):1.6V~2.6V;功率:65mW;正向电流:20mA;主波长:586nm~595nm;透镜颜色:无色透明透镜;发光强度:100mcd~220mcd;发光角度:130°;工作温度:-30℃~+85℃;; Supplier Part: C89811; Manufacturer: 国星光电; Supplier Footprint: 0603; JLCPCB Part Class: Extended Part; Datasheet: https://atta.szlcsc.com/upload/public/pdf/source/20200820/C89811_7FE84B429B6BCA3E113B125EE1452576.pdf; Supplier: LCSC; Emitted Color: 黄色; Forward Voltage (VF): 1.6V~2.6V; Power Dissipation: 65mW; Forward Current: 20mA; Dominant Wavelength: 586nm~595nm; Lens Color: 无色透明透镜; Luminous Intensity: 100mcd~220mcd; Viewing Angle: 130°; Operating Temperature: -30℃~+85℃
5V GND RX TX = Test-Point_1: Test Point 测试点
B1 = HX-9042: Supplier Part: C9900014398; Supplier Footprint: 9042; JLCPCB Part Class: 扩展库; Datasheet: https://atta.szlcsc.comnull; Supplier: LCSC
C2 C5 C10 C15-C18 C20 C21 C24 C26 C53-C55 C63 C68 C69 C73 = CC0603KRX7R9BB104: 容值:100nF;精度:±10%;额定电压:50V;温度系数:X7R;; LCSC Part Name: 100nF ±10% 50V; Supplier Part: C14663; Manufacturer: YAGEO(国巨); Supplier Footprint: 0603; JLCPCB Part Class: Basic Part; Datasheet: https://item.szlcsc.com/datasheet/CC0603KRX7R9BB104/15331.html; Supplier: LCSC; Tolerance: ±10%; Voltage Rating: 50V; Temperature Coefficient: X7R
CN1 = ZX-XH2.54-2PWT: 插针结构:1x2P;间距:2.54mm;安装方式:卧贴;参考系列:XH;总PIN数:2P;排数:1;每排PIN数:2;行距:-;额定电流:3A;触头材质:黄铜;触头镀层:锡;工作温度范围:-25℃~+85℃;; Supplier Part: C7429671; Manufacturer: Megastar(兆星); Supplier Footprint: SMD,P=2.54mm,卧贴; JLCPCB Part Class: 扩展库; Datasheet: https://atta.szlcsc.com/upload/public/pdf/source/20230619/D2020A0565D707024C90AEAD14B7AF42.pdf; Supplier: LCSC; Pins Structure: 1x2P; Pitch: 2.54mm; Mounting Style: 卧贴; Reference Series: XH; Number of Pins: 2P; Number of Rows: 1; Number of PINs Per Row: 2; Current Rating (Max): 3A; Contact Material: 黄铜; Contact Plating: 锡; Operating Temperature Range: -25℃~+85℃
CRYSTAL1 = CF4008M00012001: 晶振类型:贴片晶振;频率:8MHz;常温频差:±10ppm;外接负载电容:12pF;频率稳定度(全温):±30ppm;; LCSC Part Name: 8MHz ±10ppm 12pF; Supplier Part: C7294546; Manufacturer: HUAXIN(华昕); Supplier Footprint: SMD-3225-4P; JLCPCB Part Class: 扩展库; Datasheet: https://atta.szlcsc.com/upload/public/pdf/source/20230614/403FD538918E19EFAFACD07D4A487DFF.pdf; Supplier: LCSC; Crystal Type: 贴片晶振; Normal temperature Frequency Tolerance: ±10ppm; External load capacitor: 12pF; Frequency Stability(Full temperature range): ±30ppm; Equivalent Series Resistance (ESR): 40Ω; Operating Temperature: -40℃~+85℃
D8 = SS54_C7420369: 二极管配置:独立式;正向压降(Vf):550mV@5A;直流反向耐压(Vr):40V;整流电流:5A;; LCSC Part Name: 电压:40V 电流:5A; Supplier Part: C7420369; Manufacturer: R+O(宏嘉诚); Supplier Footprint: SMA(DO-214AC); JLCPCB Part Class: Extended Part; Datasheet: https://item.szlcsc.com/datasheet/SS54/8397191.html; Supplier: LCSC; Diode Configuration: 独立式; Voltage - Forward(Vf@If): 550mV@5A; Voltage - DC Reverse(Vr): 40V; Current - Rectified: 5A; Reverse Leakage Current (Ir): 50uA@40V; Operating Junction Temperature Range: -55℃~+125℃; Non-Repetitive Peak Forward Surge Current: 120A
H1 = HDR-F_2.54_1x4P: Supplier Part: C2718488; Supplier Footprint: 插件
H3 = PZ254R-11-04P: 插针结构:1x4P;间距:2.54mm;行距:-;圆针/方针:方针;安装类型:弯插;排数:单排;总PIN位数:4P;额定电流:-;额定电压:-;配合针长度:6mm;塑高:2.5mm;触头材质:黄铜;触头镀层:-;工作温度范围:-40℃~+105℃;颜色:黑色;; LCSC Part Name: 间距:2.54mm 1x4P 弯插 方针; Supplier Part: C492412; Manufacturer: XFCN(兴飞); Supplier Footprint: 弯插,P=2.54mm; JLCPCB Part Class: 扩展库; Datasheet: https://atta.szlcsc.com/upload/public/pdf/source/20200309/C492412_B0EFFC1946AB079B8871416C4A09EF6C.pdf; Supplier: LCSC; Pin Structure: 1x4P; Pitch: 2.54mm; Circluar Pins/Square Pins: 方针; Mounting Type: 弯插; Number of Rows: 单排; Number of Pins: 4P; Length of Mating Pin: 6mm; Insulation Height: 2.5mm; Contact Material: 黄铜; Operating Temperature Range: -40℃~+105℃; Color: 黑色
LED1 LED8 = LED_0603-G: Supplier Footprint: 0603
LED2 = LED_0603-R: Supplier Footprint: 0603
OLED1 = HS96L01W4S03: 尺寸(inch):0.96;像素分辨率:128x64;; LCSC Part Name: 0.96寸 白光 128x64像素分辨率; Supplier Part: C5139758; Manufacturer: HS(汉昇); JLCPCB Part Class: Extended Part; Datasheet: https://item.szlcsc.com/datasheet/HS96L01W4S03/5751920.html; Supplier: LCSC; Size: 0.96; Dot Pixels: 128x64; Operating Temperature: -40℃~+80℃; Type of Drive: 无源(PMOLED); Display Range: 21.74x10.86mm; Display Color: 白色; Luminance: 100cd/m2; Quiescent Current: 5uA
Q2 = S8050: NPN 25V 500mA 120-400 SOT-23; LCSC Part Name: NPN 25V 500mA 120-400 SOT-23; Supplier Part: C2931719; Manufacturer: Doeshare(德芯); Supplier Footprint: SOT-23; JLCPCB Part Class: 扩展库; Datasheet: https://atta.szlcsc.com/upload/public/pdf/source/20220117/E6D3315E0D6ADDB25840BFFAC039C5C0.pdf; Supplier: LCSC
R5 R10 R14 = 0603WAF1002T5E: 电阻类型:厚膜电阻;阻值:10kΩ;精度:±1%;功率:100mW;工作电压:75V;温度系数:±100ppm/℃;; LCSC Part Name: 厚膜电阻 10kΩ ±1% 100mW; Supplier Part: C25804; Manufacturer: UNI-ROYAL(厚声); Supplier Footprint: 0603; JLCPCB Part Class: Basic Part; Datasheet: https://item.szlcsc.com/datasheet/0603WAF1002T5E/26547.html; Supplier: LCSC; Type: 厚膜电阻; Tolerance: ±1%; Power(Watts): 100mW; Voltage-Supply(Max): 75V; Temperature Coefficient: ±100ppm/℃; Operating Temperature: -55℃~+155℃
R11 R13 = 0603WAF2201T5E: 电阻类型:厚膜电阻;阻值:2.2kΩ;精度:±1%;功率:100mW;最大工作电压:75V;温度系数:±100ppm/℃;; LCSC Part Name: 2.2kΩ ±1% 100mW 厚膜电阻; Supplier Part: C4190; Manufacturer: UNI-ROYAL(厚声); Supplier Footprint: 0603; JLCPCB Part Class: Basic Part; Datasheet: https://atta.szlcsc.com/upload/public/pdf/source/20200306/C422600_1E6D84923E4A46A82E41ADD87F860B5C.pdf; Supplier: LCSC; Type: 厚膜电阻; Tolerance: ±1%; Power(Watts): 100mW; Overload Voltage (Max): 75V; Temperature Coefficient: ±100ppm/℃; Operating Temperature Range: -55℃~+155℃
SCREW1-SCREW4 = M3螺丝: Supplier Footprint: 插件
SW1 = EC11L1525G01: Supplier Part: C2991196; Manufacturer: ALPSALPINE(阿尔卑斯阿尔派); Supplier Footprint: 插件; JLCPCB Part Class: Extended Part; Datasheet: https://atta.szlcsc.com/upload/public/pdf/source/20220411/178C78D91D042177C355D008FA29ADBD.pdf; Supplier: LCSC
SW5 = TS24CA: 电路结构:单刀单掷;按钮形状:矩形按钮;安装方式:卧贴;开关长度:4.55mm;开关宽度:1.8mm;开关高度:3.5mm;触点电流:50mA;额定电压(DC):12V;带灯:-;机械寿命:-;; LCSC Part Name: 4.55*1.8*3.5mm 卧贴 轻触开关; Supplier Part: C393942; Manufacturer: SHOU HAN(首韩); Supplier Footprint: SMD; JLCPCB Part Class: 扩展库; Datasheet: https://atta.szlcsc.com/upload/public/pdf/source/20190521/C393942_591A9E318887EFA4274D34029981AD99.pdf; Supplier: LCSC; Circuit: 单刀单掷; Actuator Style: 矩形按钮; Mounting Style: 卧贴; Switch Length: 4.55mm; Switch Width: 1.8mm; Switch Height: 3.5mm; Contact Current: 50mA; Voltage Rating (DC): 12V
U10 = LIS3MDLTR: 3轴MEMS磁场传感器，数字输出，I2C/SPI，低功耗模式，高性能; LCSC Part Name: 三轴数字磁传感器; Supplier Part: C478483; Manufacturer: ST(意法半导体); Supplier Footprint: LGA-12(2x2); JLCPCB Part Class: 扩展库; Datasheet: https://atta.szlcsc.com/upload/public/pdf/source/20191231/C478483_325C07DDDEF2D93C2E541FB70AD6AC5C.pdf; Supplier: LCSC
U12 = LSM6DSRTR: 传感器类型:加速度计陀螺仪;接口类型:I2C；SPI；MIPI I3C;; LCSC Part Name: iNEMO惯性模块:常开3D加速度计和3D陀螺仪; Supplier Part: C784817; Manufacturer: ST(意法半导体); Supplier Footprint: LGA-14(2.5x3); JLCPCB Part Class: Extended Part; Datasheet: https://item.szlcsc.com/datasheet/LSM6DSRTR/840864.html; Supplier: LCSC; Accelerometer Sensing Axis: X,Y,Z; Acceleration Measurement Range (MAX): ±16g; Gyroscope Sensing Axis: X,Y,Z; Gyroscope Measurement Range (MAX): ±4000dps; Sensor Type: 加速度计陀螺仪; Interface: I2C；SPI；MIPI I3C; Voltage - Supply: 1.71V~3.6V; Cache Size: 9KB; Operating Temperature: -40℃~+85℃
U14 = STM32F405RGT6: CPU内核:ARM-M4;程序存储容量:1MB;RAM总容量:192KB;GPIO端口数量:51;工作电压范围:1.8V~3.6V;CPU最大主频:168MHz;程序存储器类型:FLASH;; LCSC Part Name: 带DSP和FPU的高性能基础系列ARM Cortex-M4 MCU，具有1 MB Flash、168 MHz CPU和ART加速器; Supplier Part: C15742; Manufacturer: ST(意法半导体); Supplier Footprint: LQFP-64(10x10); JLCPCB Part Class: 扩展库; Datasheet: https://atta.szlcsc.com/upload/public/pdf/source/20140801/1457707197138.pdf; Supplier: LCSC; CPU Core: ARM-M4; Program Storage Size: 1MB; RAM Size: 192KB; GPIO Ports Number: 51; Operating Voltage Range: 1.8V~3.6V; CPU Maximum Speed: 168MHz; Program Memory Type: FLASH; Operating Temperature Range: -40℃~+85℃; ADC (Bit): 12bit; DAC (Bit): 12bit; Universal Serial Bus: 有; Peripheral/Function: DMA；LCD/LED驱动；PWM; Watchdog: 有; Infrared Data Association: 有; Low-Voltage Detect: 有; LCD Module: 有; Direct Memory Access: 有; Internal Oscillator: 有
U15 = MB85RC64TAPNF-G-BDERE1: Supplier Part: C189804; Manufacturer: FUJITSU(富士通); Supplier Footprint: SOP-8; JLCPCB Part Class: 扩展库; Datasheet: https://atta.szlcsc.com/upload/public/pdf/source/20180403/C189905_A8E0CA722DC8D83A10C1D27357EA684E.pdf; Supplier: LCSC
U16 = TJA1050T-JSM: LCSC Part Name: TJA1050T; Supplier Part: C21714366; Manufacturer: JSMSEMI(杰盛微); Supplier Footprint: SOP-8; JLCPCB Part Class: 扩展库; Datasheet: https://atta.szlcsc.com/upload/public/pdf/source/20240307/226A42A673340FFB74D7F8B5A383F6D1.pdf; Supplier: LCSC
X1 = X321532768KGD2SI: 晶振类型:贴片晶振;频率:32.768kHz;常温频差:±20ppm;外接负载电容:12.5pF;频率稳定度(全温):-;; LCSC Part Name: 32.768kHz ±20ppm 12.5pF; Supplier Part: C620155; Manufacturer: YXC(扬兴晶振); Supplier Footprint: SMD3215-2P; JLCPCB Part Class: 扩展库; Datasheet: https://atta.szlcsc.com/upload/public/pdf/source/20240329/3A7650FD985DD0DE85694D3785AB4916.pdf; Supplier: LCSC; Crystal Type: 贴片晶振; Normal temperature Frequency Tolerance: ±20ppm; External load capacitor: 12.5pF; Operating Temperature: -40℃~+85℃

## Nets
3V3: C1.2 C2.1 C15.2 C17.2 C18.1 C20.1 C59.2 C61.1 C62.2 C64.1 C66.1 C67.1 C82.2 C83.2 C84.2 CN2.5 CN6.5 CN14.5 CN15.5 H3.1 LED6.2(A) LED7.2(A) OLED1.2(VCC) R10.2 R11.2 R13.2 R14.2 R20.2 R24.1 R26.2 R27.2 R35.2 R38.2 R47.2 U1.5(VOUT) U2.5(VS) U9.5(VCC) U10.5(Vdd) U10.6(Vdd_IO) U12.5(VDDIO) U12.8(VDD) U15.8(VDD) U19.5(VCC)
3V3_MCU: C10.1 C14.1 C21.1 C24.1 C30.2 C63.1 C68.1 C69.1 R18.2 R22.2 R23.2 U5.5(VOUT) U14.1(VBAT) U14.13(VDDA) U14.19(VDD) U14.32(VDD) U14.48(VDD) U14.64(VDD)
5V: 5V.1 C11.2 C12.1 C26.2 C60.2 D2.2(K) D8.2(K) H1.1 R36.2 R43.2 U1.1(VIN) U1.3(CE) U5.1(VIN) U5.3(CE) U16.3(VCC)
5V_RDK: D5.2(K) F1.1 R3.2 R34.2
5V_RDK_1: C48.2 C49.2 CN7.1(+) L2.4
DGND: C2.2 C5.2 C10.2 C11.1 C12.2 C14.2 C15.1 C16.1 C17.1 C18.2 C20.2 C21.2 C24.2 C26.1 C30.1 C34.1 C38.1 C50.2 C52.1 C53.1 C54.1 C55.2 C59.1 C60.1 C61.2 C62.1 C63.2 C64.2 C65.2 C66.2 C67.2 C68.2 C69.2 C70.2 C72.2 C73.1 C74.1 C75.2 C76.1 C77.2 C82.1 C83.1 C84.1 CN2.2 CN6.2 CN14.2 CN15.2 H1.2 H3.4 L9.2 LED1.1(C) LED8.1(C) OLED1.1(GND) Q2.2(E) R5.2 R6.2 R7.1 R12.1 R17.1 R25.2 R29.2 R32.1 R33.1 R48.1 R49.1 R53.1 R54.1 R55.1 R62.1 SCREW1.1 SCREW2.1 SCREW3.1 SCREW4.1 SW1.C SW1.E SW5.4 U1.2(GND) U5.2(GND) U9.3(GND) U10.2(Res) U10.3(GND) U10.12(Res) U12.2(SDX) U12.3(SCX) U12.6(GND) U12.7(GND) U14.12(VSSA) U14.18(VSS) U14.63(VSS) U15.1(A0) U15.2(A1) U15.3(A2) U15.4(VSS) U16.2(GND) U16.8(S) U18.1(1OE#) U18.4(2OE#) U18.7(GND) U18.10(3OE#) U18.13(4OE#) U19.3(GND) U21.1(1OE#) U21.4(2OE#) U21.7(GND) U21.10(3OE#) U21.13(4OE#) USB1.1(GND) USB1.12(GND) USB1.13(SHELL) USB1.14(SHELL) USB2.1(GND) USB2.12(GND) USB2.13(SHELL) USB2.14(SHELL)
DVDD: C34.2 C38.2 C90.2 U6.8(DVDD) U18.14(VCC) U21.14(VCC)
GND: C1.1 C56.1 C57.1 L3.2 R50.1 U2.1(A1) U2.2(A0) U2.6(GND) U3.1
PGND: C4.2 C6.1 C8.1 C9.1 C19.1 C27.1 C28.1 C29.2 C32.1 C33.2 C37.1 C39.2 C40.2 C41.1 C43.1 C44.1 C45.1 C46.2 C47.1 C51.2 C58.1 C90.1 C91.1 C92.2 C93.2 C95.1 C96.2 C99.1 C100.2 C102.1 C103.2 GND.1 L2.2 L3.3 L9.1 LED3.1(C) LED4.1(C) LED5.1(C) Q5.1(S) Q5.2(S) Q5.3(S) Q6.1(S) Q6.2(S) Q6.3(S) Q9.1(S) Q9.2(S) Q9.3(S) Q10.1(S) Q10.2(S) Q10.3(S) Q21.1(S) Q21.2(S) Q21.3(S) Q22.1(S) Q22.2(S) Q22.3(S) Q25.1(S) Q25.2(S) Q25.3(S) Q26.1(S) Q26.2(S) Q26.3(S) R15.2 R16.1 R41.2 R42.1 SW3.1 U4.7(GND) U4.9(EP) U6.5(GND) U6.16(GND) U6.20(SN) U6.21(SP) U6.25(EP) U7.5(GND) U7.16(GND) U7.20(SN) U7.21(SP) U7.25(EP) U8.7(GND) U8.9(EP) U11.5(GND) U11.16(GND) U11.20(SN) U11.21(SP) U11.25(EP) U13.5(GND) U13.16(GND) U13.20(SN) U13.21(SP) U13.25(EP) ZD1.2(A) 使能.1(C) 电源.1(C)
VBUS: D8.1(A) USB1.2(VBUS) USB1.11(VBUS)
VCCBAT: C58.2 D1.1(A) D4.1(A) L3.4 R52.2
VIN: D6.2(A) D7.2(A) D10.2(A) D11.2(A) L3.1 Q7.5(D) Q7.6(D) Q7.7(D) Q7.8(D) Q7.9(D) Q11.5(D) Q11.6(D) Q11.7(D) Q11.8(D) Q11.9(D) Q23.5(D) Q23.6(D) Q23.7(D) Q23.8(D) Q23.9(D) Q27.5(D) Q27.6(D) Q27.7(D) Q27.8(D) Q27.9(D) R1.2 R8.2 U2.7(IN-)
BLUTOOTH_RX: H1.3 U14.52(PC11)
BLUTOOTH_TX: H1.4 U14.51(PC10)
BOOT0: R5.1 U14.60(BOOT0)
BOOT1: R7.2 U14.28(PB2-BOOT1(PB2))
BUZZER: R21.1 R25.1 U14.11(PC3)
CAN1_RX: U14.44(PA11) U16.4(RXD)
CAN1_TX: U14.45(PA12) U16.1(TXD)
CANH: CN1.1 R37.2 R45.2 U16.7(CANH)
CANL: CN1.2 R44.1 R46.1 U16.6(CANL)
DEBUG_RX: U9.6(TXD) U14.43(PA10)
DEBUG_TX: U9.7(RXD) U14.42(PA9)
GMR_L1A: CN2.4 U14.58(PB6)
GMR_L1B: CN2.3 U14.59(PB7)
GMR_L2A: CN6.4 U14.37(PC6)
GMR_L2B: CN6.3 U14.38(PC7)
GMR_R1A: CN14.4 U14.56(PB4(NJTRST))
GMR_R1B: CN14.3 U14.57(PB5)
GMR_R2A: CN15.4 U14.50(PA15(JTDI))
GMR_R2B: CN15.3 U14.55(PB3(JTDOTRACESWO))
I2C1_SCL: OLED1.3(SCL) R23.1 U2.4(SCL) U14.61(PB8) U15.6(SCL)
I2C1_SDA: OLED1.4(SDA) R22.1 U2.3(SDA) U14.62(PB9) U15.5(SDA)
IMU_CS: R14.1 U12.12(CS) U14.8(PC0)
IMU_INT: U12.4(INT1) U14.39(PC8)
IMU_MISO: R10.1 U10.9(SD0/SA1) U12.1(SDO/SA0) U14.35(PB14)
IMU_MOSI: R13.1 U10.11(SDA/SDI/SDO) U12.14(SDA) U14.36(PB15)
IMU_SCK: R11.1 U10.1(SCL/SPC) U12.13(SCL) U14.34(PB13)
KEY1: C54.2 R20.1 SW1.A U14.40(PC9)
KEY2: C55.1 R35.1 SW1.B U14.25(PC5)
KEY3: C53.2 R47.1 SW1.D U14.10(PC2)
L1-DIR: R59.1 R62.2 U18.5(2A)
L1-DIR-OUT: U6.15(PH) U18.6(2Y)
L1-EN: R49.2 R60.1 U18.2(1A)
L1-EN-OUT: U6.14(EN) U18.3(1Y)
L2-DIR: R6.1 R61.1 U18.9(3A)
L2-DIR-OUT: U7.15(PH) U18.8(3Y)
L2-EN: R48.2 R58.1 U18.12(4A)
L2-EN-OUT: U7.14(EN) U18.11(4Y)
LIGHT: U14.26(PB0)
LIS3_CS: U10.10(CS) U14.9(PC1)
LIS3_DRDY: U10.8(DRDY) U14.33(PB12)
MCO_32K: U12.9(INT2) U14.41(PA8)
ML1_DIR: R59.2 U14.20(PA4)
ML1_OUTN: CN2.1 Q22.5(D) Q22.6(D) Q22.7(D) Q22.8(D) Q22.9(D) Q23.1(S) Q23.2(S) Q23.3(S) U6.18(SH1)
ML1_OUTP: CN2.6 Q20.1(S) Q20.2(S) Q20.3(S) Q21.5(D) Q21.6(D) Q21.7(D) Q21.8(D) Q21.9(D) U6.23(SH2)
ML1_PWM: R60.2 U14.14(PA0-WKUP(PA0))
ML2_DIR: R61.2 U14.24(PC4)
ML2_OUTN: CN6.1 Q6.5(D) Q6.6(D) Q6.7(D) Q6.8(D) Q6.9(D) Q7.1(S) Q7.2(S) Q7.3(S) U7.18(SH1)
ML2_OUTP: CN6.6 Q4.1(S) Q4.2(S) Q4.3(S) Q5.5(D) Q5.6(D) Q5.7(D) Q5.8(D) Q5.9(D) U7.23(SH2)
ML2_PWM: R58.2 U14.16(PA2)
MR1_DIR: R64.2 U14.21(PA5)
MR1_OUTN: CN14.1 Q10.5(D) Q10.6(D) Q10.7(D) Q10.8(D) Q10.9(D) Q11.1(S) Q11.2(S) Q11.3(S) U11.18(SH1)
MR1_OUTP: CN14.6 Q8.1(S) Q8.2(S) Q8.3(S) Q9.5(D) Q9.6(D) Q9.7(D) Q9.8(D) Q9.9(D) U11.23(SH2)
MR1_PWM: R65.2 U14.15(PA1)
MR2_DIR: R66.2 U14.27(PB1)
MR2_OUTN: CN15.1 Q26.5(D) Q26.6(D) Q26.7(D) Q26.8(D) Q26.9(D) Q27.1(S) Q27.2(S) Q27.3(S) U13.18(SH1)
MR2_OUTP: CN15.6 Q24.1(S) Q24.2(S) Q24.3(S) Q25.5(D) Q25.6(D) Q25.7(D) Q25.8(D) Q25.9(D) U13.23(SH2)
MR2_PWM: R63.2 U14.17(PA3)
NSLEEP: R57.2 SW3.2 U6.13(nSLEEP) U7.13(nSLEEP) U11.13(nSLEEP) U13.13(nSLEEP)
R1-DIR: R55.2 R64.1 U21.5(2A)
R1-DIR-OUT: U11.15(PH) U21.6(2Y)
R1-EN: R54.2 R65.1 U21.2(1A)
R1-EN-OUT: U11.14(EN) U21.3(1Y)
R2-DIR: R29.1 R66.1 U21.9(3A)
R2-DIR-OUT: U13.15(PH) U21.8(3Y)
R2-EN: R53.2 R63.1 U21.12(4A)
R2-EN-OUT: U13.14(EN) U21.11(4Y)
RDK-X5_RX: R30.1 U14.30(PB11) U19.6(TXD)
RDK-X5_TX: R31.1 U14.29(PB10) U19.7(RXD)
SERVO1: U14.22(PA6)
SERVO2: U14.23(PA7)
SWCLK: H3.3 U14.49(PA14(JTCK-SWCLK))
SWDIO: H3.2 U14.46(PA13(JTMS-SWDIO))
TC1_DN: U19.2(UD-) USB2.5(DN2) USB2.7(DN1)
TC1_DP: U19.1(UD+) USB2.6(DP1) USB2.8(DP2)
TC_DN: U9.2(UD-) USB1.5(DN2) USB1.7(DN1)
TC_DP: U9.1(UD+) USB1.6(DP1) USB1.8(DP2)
UART5_RX: RX.1 U14.54(PD2)
UART5_TX: TX.1 U14.53(PC12)
USER_LED: LED2.1(C) U14.2(PC13)
VCAP1: C70.1 U14.31(VCAP_1)
VCAP2: C72.1 U14.47(VCAP_2)
VM_3.3V: R8.1 R56.2 SW3.3 ZD1.1(K)
XTAL32_IN: C75.1 U14.3(PC14-OSC32_IN(PC14)) X1.2
XTAL32_OUT: C77.1 U14.4(PC15-OSC32_OUT(PC15)) X1.1
XTAL_IN: C74.2 CRYSTAL1.3 U14.5(PH0-OSC_IN(PH0))
XTAL_OUT: C76.2 CRYSTAL1.1 U14.6(PH1-OSC_OUT(PH1))
~RST: C73.2 R38.1 SW5.3 U14.7(NRST)
$1N11989: R3.1 R4.2
$1N11991: C9.2 C39.1 D5.1(A) L4.2
$1N11994: R2.2 U4.6(COMP)
$1N11995: LED4.2(A) R34.1
$1N11996: R4.1 R15.1 U4.5(FB)
$1N11997: C7.2 L4.1 U4.8(SW)
$1N11998: C7.1 U4.1(BOOT)
$1N11999: C8.2 R2.1
$1N12000: R16.2 U4.4(RT/CLK)
$1N12001: C4.1 C6.2 C19.2 D4.2(K) U4.2(VIN) U4.3(EN)
$1N12003: R36.1 R40.2
$1N12005: C44.2 C46.1 D2.1(A) L1.2
$1N12008: R9.2 U8.6(COMP)
$1N12009: LED3.2(A) R43.1
$1N12010: R40.1 R41.1 U8.5(FB)
$1N12011: C42.2 L1.1 U8.8(SW)
$1N12012: C42.1 U8.1(BOOT)
$1N12013: C43.2 R9.1
$1N12014: R42.2 U8.4(RT/CLK)
$1N12015: C40.1 C41.2 C45.2 D1.2(K) U8.2(VIN) U8.3(EN)
$1N12062: LED5.2(A) R52.1
$1N12064: C56.2 R51.1
$1N12065: K1.2 Q3.1(G)
$1N12066: D3.2(A) K1.3 R50.2
$1N12069: D3.1(K) K1.1 Q3.3(S) U3.2
$1N12071: C57.2 Q3.2(D) R1.1 R51.2 U2.8(IN+)
$1N12081: C48.1 C49.1 CN7.2(-) L2.3
$1N12084: C47.2 F1.2 L2.1
$1N12101: LED7.1(C) R31.2
$1N12104: LED6.1(C) R30.2
$1N12143: C65.1 U19.8(V3)
$1N12145: R32.2 USB2.10(CC2)
$1N12147: R33.2 USB2.4(CC1)
$2N586: C16.2 U9.8(V3)
$2N604: R17.2 USB1.4(CC1)
$2N609: R12.2 USB1.10(CC2)
$2N3644: LED1.2(A) R26.1
$2N3645: LED2.2(A) R27.1
$2N29956: C52.2 R45.1 R46.2
$2N29957: C50.1 R37.1 R44.2
$2N29968: Q2.1(B) R21.2
$2N29970: B1.2 Q2.3(C)
$2N29971: B1.1 R24.2
$2N30278: LED8.2(A) R18.1
$3N9: R57.1 使能.2(A)
$3N10: R56.1 电源.2(A)
$3N150: Q21.4(G) U6.22(GL2)
$3N151: Q20.4(G) U6.24(GH2)
$3N152: Q22.4(G) U6.19(GL1)
$3N153: Q23.4(G) U6.17(GH1)
$3N164: C91.2 C92.1 U6.6(VREF) U6.7(AVDD) U6.12(IDRIVE)
$3N165: C23.2 U6.4(CPL)
$3N166: C23.1 U6.3(CPH)
$3N167: C22.1 U6.2(VCP)
$3N170: C22.2 C28.2 C51.1 D10.1(K) Q20.5(D) Q20.6(D) Q20.7(D) Q20.8(D) Q20.9(D) U6.1(VM)
$3N175: Q5.4(G) U7.22(GL2)
$3N176: Q4.4(G) U7.24(GH2)
$3N177: Q6.4(G) U7.19(GL1)
$3N178: Q7.4(G) U7.17(GH1)
$3N189: C32.2 C33.1 U7.6(VREF) U7.7(AVDD) U7.12(IDRIVE)
$3N190: C25.2 U7.4(CPL)
$3N191: C25.1 U7.3(CPH)
$3N192: C3.1 U7.2(VCP)
$3N193: C3.2 C27.2 C29.1 D6.1(K) Q4.5(D) Q4.6(D) Q4.7(D) Q4.8(D) Q4.9(D) U7.1(VM)
$3N197: Q9.4(G) U11.22(GL2)
$3N198: Q8.4(G) U11.24(GH2)
$3N199: Q10.4(G) U11.19(GL1)
$3N200: Q11.4(G) U11.17(GH1)
$3N211: C95.2 C96.1 U11.6(VREF) U11.7(AVDD) U11.12(IDRIVE)
$3N212: C36.2 U11.4(CPL)
$3N213: C36.1 U11.3(CPH)
$3N214: C35.1 U11.2(VCP)
$3N215: C35.2 C37.2 C93.1 D7.1(K) Q8.5(D) Q8.6(D) Q8.7(D) Q8.8(D) Q8.9(D) U11.1(VM)
$3N219: Q25.4(G) U13.22(GL2)
$3N220: Q24.4(G) U13.24(GH2)
$3N221: Q26.4(G) U13.19(GL1)
$3N222: Q27.4(G) U13.17(GH1)
$3N233: C102.2 C103.1 U13.6(VREF) U13.7(AVDD) U13.12(IDRIVE)
$3N234: C98.2 U13.4(CPL)
$3N235: C98.1 U13.3(CPH)
$3N236: C97.1 U13.2(VCP)
$3N237: C97.2 C99.2 C100.1 D11.1(K) Q24.5(D) Q24.6(D) Q24.7(D) Q24.8(D) Q24.9(D) U13.1(VM)
Net-(C5-1): C5.1 U10.4(C1)

Not connected (* = marked no-connect by the designer): CN1 3* 4*; CN2 7* 8*; CN6 7* 8*; CN14 7* 8*; CN15 7* 8*; CRYSTAL1 2(GND)* 4(GND)*; SW1 6(EH)* 7(EH)*; SW5 1* 2*; U1 4(NC)*; U5 4(NC)*; U6 9(nFAULT)* 10(SNSOUT)* 11(SO)*; U7 8(DVDD)* 9(nFAULT)* 10(SNSOUT)* 11(SO)*; U9 4(RTS#)*; U10 7(INT)*; U11 8(DVDD)* 9(nFAULT)* 10(SNSOUT)* 11(SO)*; U12 10(OCS_AUX)* 11(SDO_AUX)*; U13 8(DVDD)* 9(nFAULT)* 10(SNSOUT)* 11(SO)*; U15 7(WP)*; U16 5(Vref)*; U19 4(RTS#)*; USB1 3(SBU2)* 9(SBU1)*; USB2 2(VBUS)* 3(SBU2)* 9(SBU1)* 11(VBUS)*

## Notes on the sheets
sheet 1
- 电池输入
- 板载RDK降压 5V 5A
- 系统供电LDO 3.3V
- 四电机驱动
- LEFT1
- RIGHT1
- LEFT2
- RIGHT2
- 板载外设降压 5V 5A
- 上层Linux主板供电 5V 5A/及通信
sheet 2
- CAN_UART3
- TypeC调试串口_UART1
- FeRAM
- 外围接口
- SWD调试接口
- 舵机接口
- SPI最大CLK频率=10MHz
- 蓝牙串口_UART6
- 侧边4PIN杜邦排针
- 陀螺仪加速度计
- 磁力计
- 主控电路
- 人机交互
- CL=12.5pF
- CL=12pF
sheet 3
- 电机1驱动电路
- 电机2驱动电路
- 缓冲电路（电机1、电机2）
- 缓冲电路（电机1、电机2）
- 电机3驱动电路
- 电机4驱动电路
- 使能信号和指示灯
- 电源及信号输入端口
